# Altium project SBC_Project.PrjPcb (part 1 of 3)
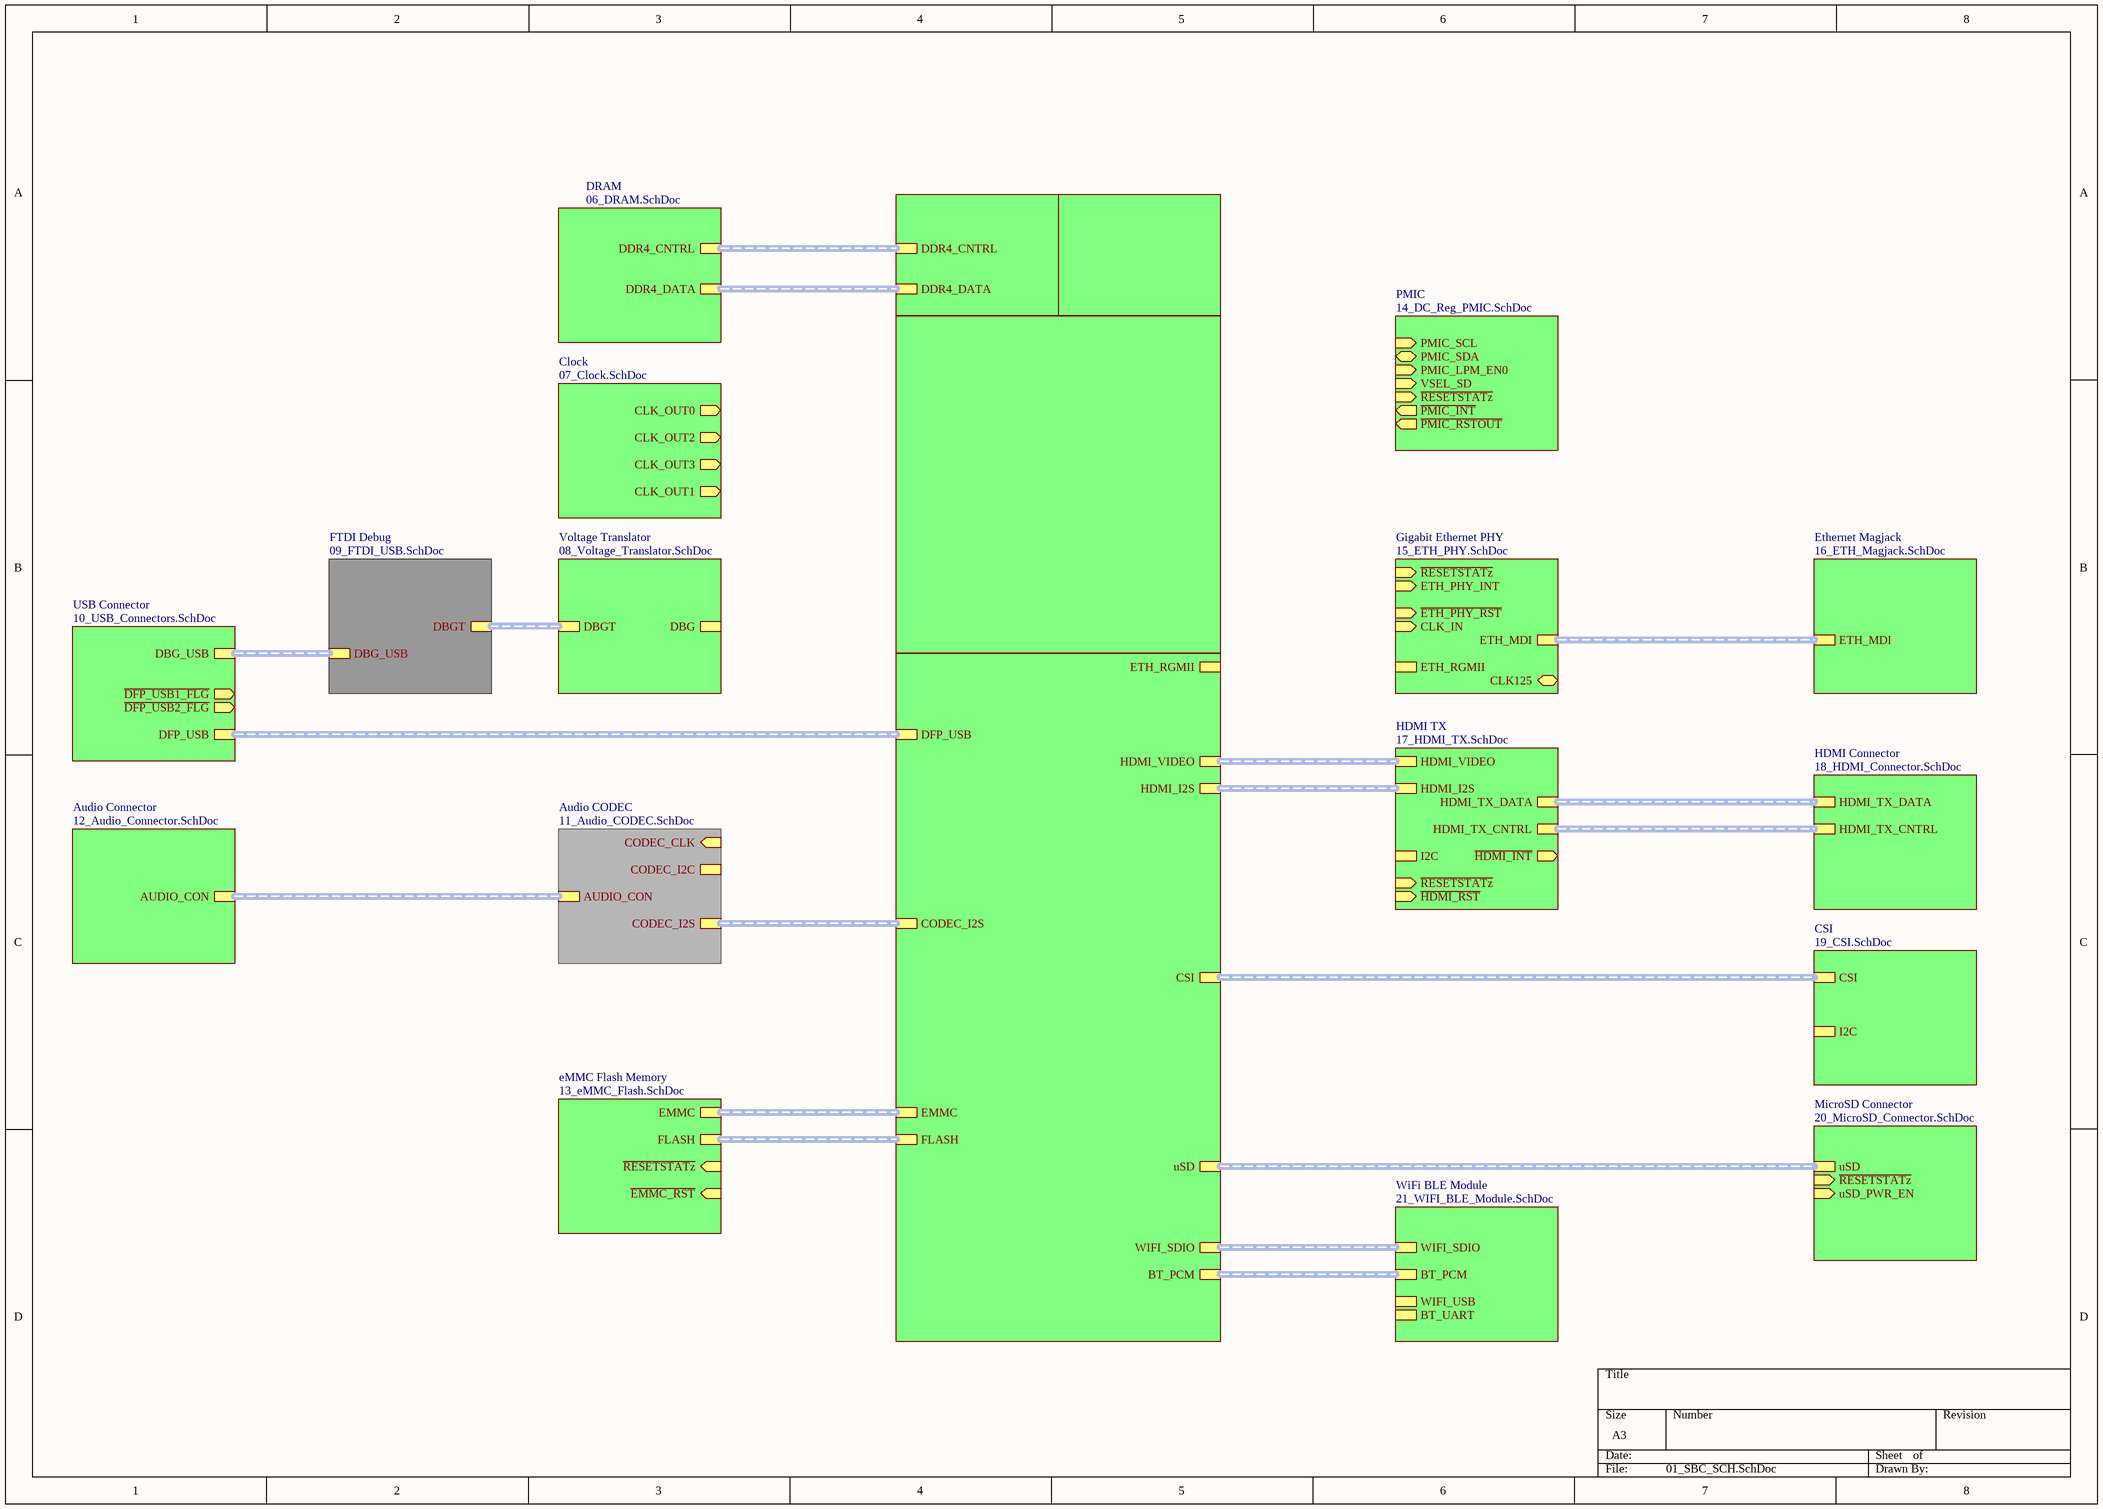
[diagram p0: 01_SBC_SCH.SchDoc]
21 sheets, 626 parts. Net scope: hierarchical (ports join the sheet entries above them; power ports are global).
Board file: SBC_PCB.PcbDoc
Sheets:
  01_SBC_SCH.SchDoc
    Audio CODEC = 11_Audio_CODEC.SchDoc
    Audio Connector = 12_Audio_Connector.SchDoc
    FTDI Debug = 09_FTDI_USB.SchDoc
    Gigabit Ethernet PHY = 15_ETH_PHY.SchDoc
    Ethernet Magjack = 16_ETH_Magjack.SchDoc
    PMIC = 14_DC_Reg_PMIC.SchDoc
    WiFi BLE Module = 21_WIFI_BLE_Module.SchDoc
    DRAM = 06_DRAM.SchDoc
    eMMC Flash Memory = 13_eMMC_Flash.SchDoc
    Voltage Translator = 08_Voltage_Translator.SchDoc
    MicroSD Connector = 20_MicroSD_Connector.SchDoc
    SoC Power = 03_SoC_Power.SchDoc
    Clock = 07_Clock.SchDoc
    SoC DRAM = 02_SoC_DRAM_DDR4.SchDoc
    SoC Interfaces = 05_SoC_Interfaces.SchDoc
    HDMI TX = 17_HDMI_TX.SchDoc
    HDMI Connector = 18_HDMI_Connector.SchDoc
    CSI = 19_CSI.SchDoc
    USB Connector = 10_USB_Connectors.SchDoc
    SoC Config & GPIOs = 04_SoC_CFG_GPIOs.SchDoc

## Sheet 01_SBC_SCH.SchDoc
size A3; SheetNumber: 1; SheetTotal: 21

### Sub-sheets
Audio CODEC = 11_Audio_CODEC.SchDoc: CODEC_I2S (harness CODEC_I2S), CODEC_I2C (harness CODEC_I2C), AUDIO_CON (harness AUDIO_CON), CODEC_CLK (in)
Audio Connector = 12_Audio_Connector.SchDoc: AUDIO_CON (harness AUDIO_CON)
Clock = 07_Clock.SchDoc: CLK_OUT0 (out), CLK_OUT1 (out), CLK_OUT2 (out), CLK_OUT3 (out)
CSI = 19_CSI.SchDoc: I2C (harness I2C), CSI (harness CSI)
DRAM = 06_DRAM.SchDoc: DDR4_CNTRL (harness DDR4_CNTRL), DDR4_DATA (harness DDR4_DATA)
eMMC Flash Memory = 13_eMMC_Flash.SchDoc: EMMC (harness EMMC), ~{RESETSTATz} (in), ~{EMMC_RST} (in), FLASH (harness FLASH)
Ethernet Magjack = 16_ETH_Magjack.SchDoc: ETH_MDI (harness ETH_MDI)
FTDI Debug = 09_FTDI_USB.SchDoc: DBGT (harness DBGT), DBG_USB (harness DBG_USB)
Gigabit Ethernet PHY = 15_ETH_PHY.SchDoc: CLK_IN (in), ETH_MDI (harness ETH_MDI), ETH_RGMII (harness ETH_RGMII), ETH_PHY_INT (in), ~{RESETSTATz} (in), ~{ETH_PHY_RST} (in), CLK125 (bidir)
HDMI Connector = 18_HDMI_Connector.SchDoc: HDMI_TX_DATA (harness HDMI_TX_DATA), HDMI_TX_CNTRL (harness HDMI_TX_CNTRL)
HDMI TX = 17_HDMI_TX.SchDoc: HDMI_VIDEO (harness HDMI_VIDEO), HDMI_I2S (harness HDMI_I2S), ~{RESETSTATz} (in), I2C (harness I2C), HDMI_TX_DATA (harness HDMI_TX_DATA), HDMI_TX_CNTRL (harness HDMI_TX_CNTRL), ~{HDMI_RST} (in), ~{HDMI_INT} (out)
MicroSD Connector = 20_MicroSD_Connector.SchDoc: uSD (harness uSD), ~{RESETSTATz} (in), uSD_PWR_EN (in)
PMIC = 14_DC_Reg_PMIC.SchDoc: PMIC_SCL (in), PMIC_SDA (bidir), PMIC_LPM_EN0 (in), VSEL_SD (in), ~{RESETSTATz} (in), ~{PMIC_INT} (out), ~{PMIC_RSTOUT} (out)
SoC Config & GPIOs = 04_SoC_CFG_GPIOs.SchDoc: no entries
SoC DRAM = 02_SoC_DRAM_DDR4.SchDoc: DDR4_CNTRL (harness DDR4_CNTRL), DDR4_DATA (harness DDR4_DATA)
SoC Interfaces = 05_SoC_Interfaces.SchDoc: EMMC (harness EMMC), WIFI_SDIO (harness WIFI_SDIO), uSD (harness uSD), FLASH (harness FLASH), BT_PCM (harness BT_PCM), CODEC_I2S (harness CODEC_I2S), ETH_RGMII (harness ETH_RGMII), HDMI_I2S (harness HDMI_I2S), HDMI_VIDEO (harness HDMI_VIDEO), CSI (harness CSI), DFP_USB (harness DFP_USB)
SoC Power = 03_SoC_Power.SchDoc: no entries
USB Connector = 10_USB_Connectors.SchDoc: DBG_USB (harness DBG_USB), DFP_USB (harness DFP_USB), ~{DFP_USB1_FLG} (out), ~{DFP_USB2_FLG} (out)
Voltage Translator = 08_Voltage_Translator.SchDoc: DBGT (harness DBGT), DBG (harness DBG)
WiFi BLE Module = 21_WIFI_BLE_Module.SchDoc: WIFI_SDIO (harness WIFI_SDIO), BT_UART (harness BT_UART), BT_PCM (harness BT_PCM), WIFI_USB (harness WIFI_USB)

### Buses and harness runs
harness sheet Audio CODEC/AUDIO_CON = sheet Audio Connector/AUDIO_CON
harness sheet Audio CODEC/CODEC_I2S = sheet SoC Interfaces/CODEC_I2S
harness sheet CSI/CSI = sheet SoC Interfaces/CSI
harness sheet DRAM/DDR4_CNTRL = sheet SoC DRAM/DDR4_CNTRL
harness sheet DRAM/DDR4_DATA = sheet SoC DRAM/DDR4_DATA
harness sheet eMMC Flash Memory/EMMC = sheet SoC Interfaces/EMMC
harness sheet eMMC Flash Memory/FLASH = sheet SoC Interfaces/FLASH
harness sheet Ethernet Magjack/ETH_MDI = sheet Gigabit Ethernet PHY/ETH_MDI
harness sheet FTDI Debug/DBG_USB = sheet USB Connector/DBG_USB
harness sheet FTDI Debug/DBGT = sheet Voltage Translator/DBGT
harness sheet HDMI Connector/HDMI_TX_CNTRL = sheet HDMI TX/HDMI_TX_CNTRL
harness sheet HDMI Connector/HDMI_TX_DATA = sheet HDMI TX/HDMI_TX_DATA
harness sheet HDMI TX/HDMI_I2S = sheet SoC Interfaces/HDMI_I2S
harness sheet HDMI TX/HDMI_VIDEO = sheet SoC Interfaces/HDMI_VIDEO
harness sheet MicroSD Connector/uSD = sheet SoC Interfaces/uSD
harness sheet SoC Interfaces/BT_PCM = sheet WiFi BLE Module/BT_PCM
harness sheet SoC Interfaces/DFP_USB = sheet USB Connector/DFP_USB
harness sheet SoC Interfaces/WIFI_SDIO = sheet WiFi BLE Module/WIFI_SDIO

## Sheet 11_Audio_CODEC.SchDoc
size A3; SheetNumber: 2; SheetTotal: 21
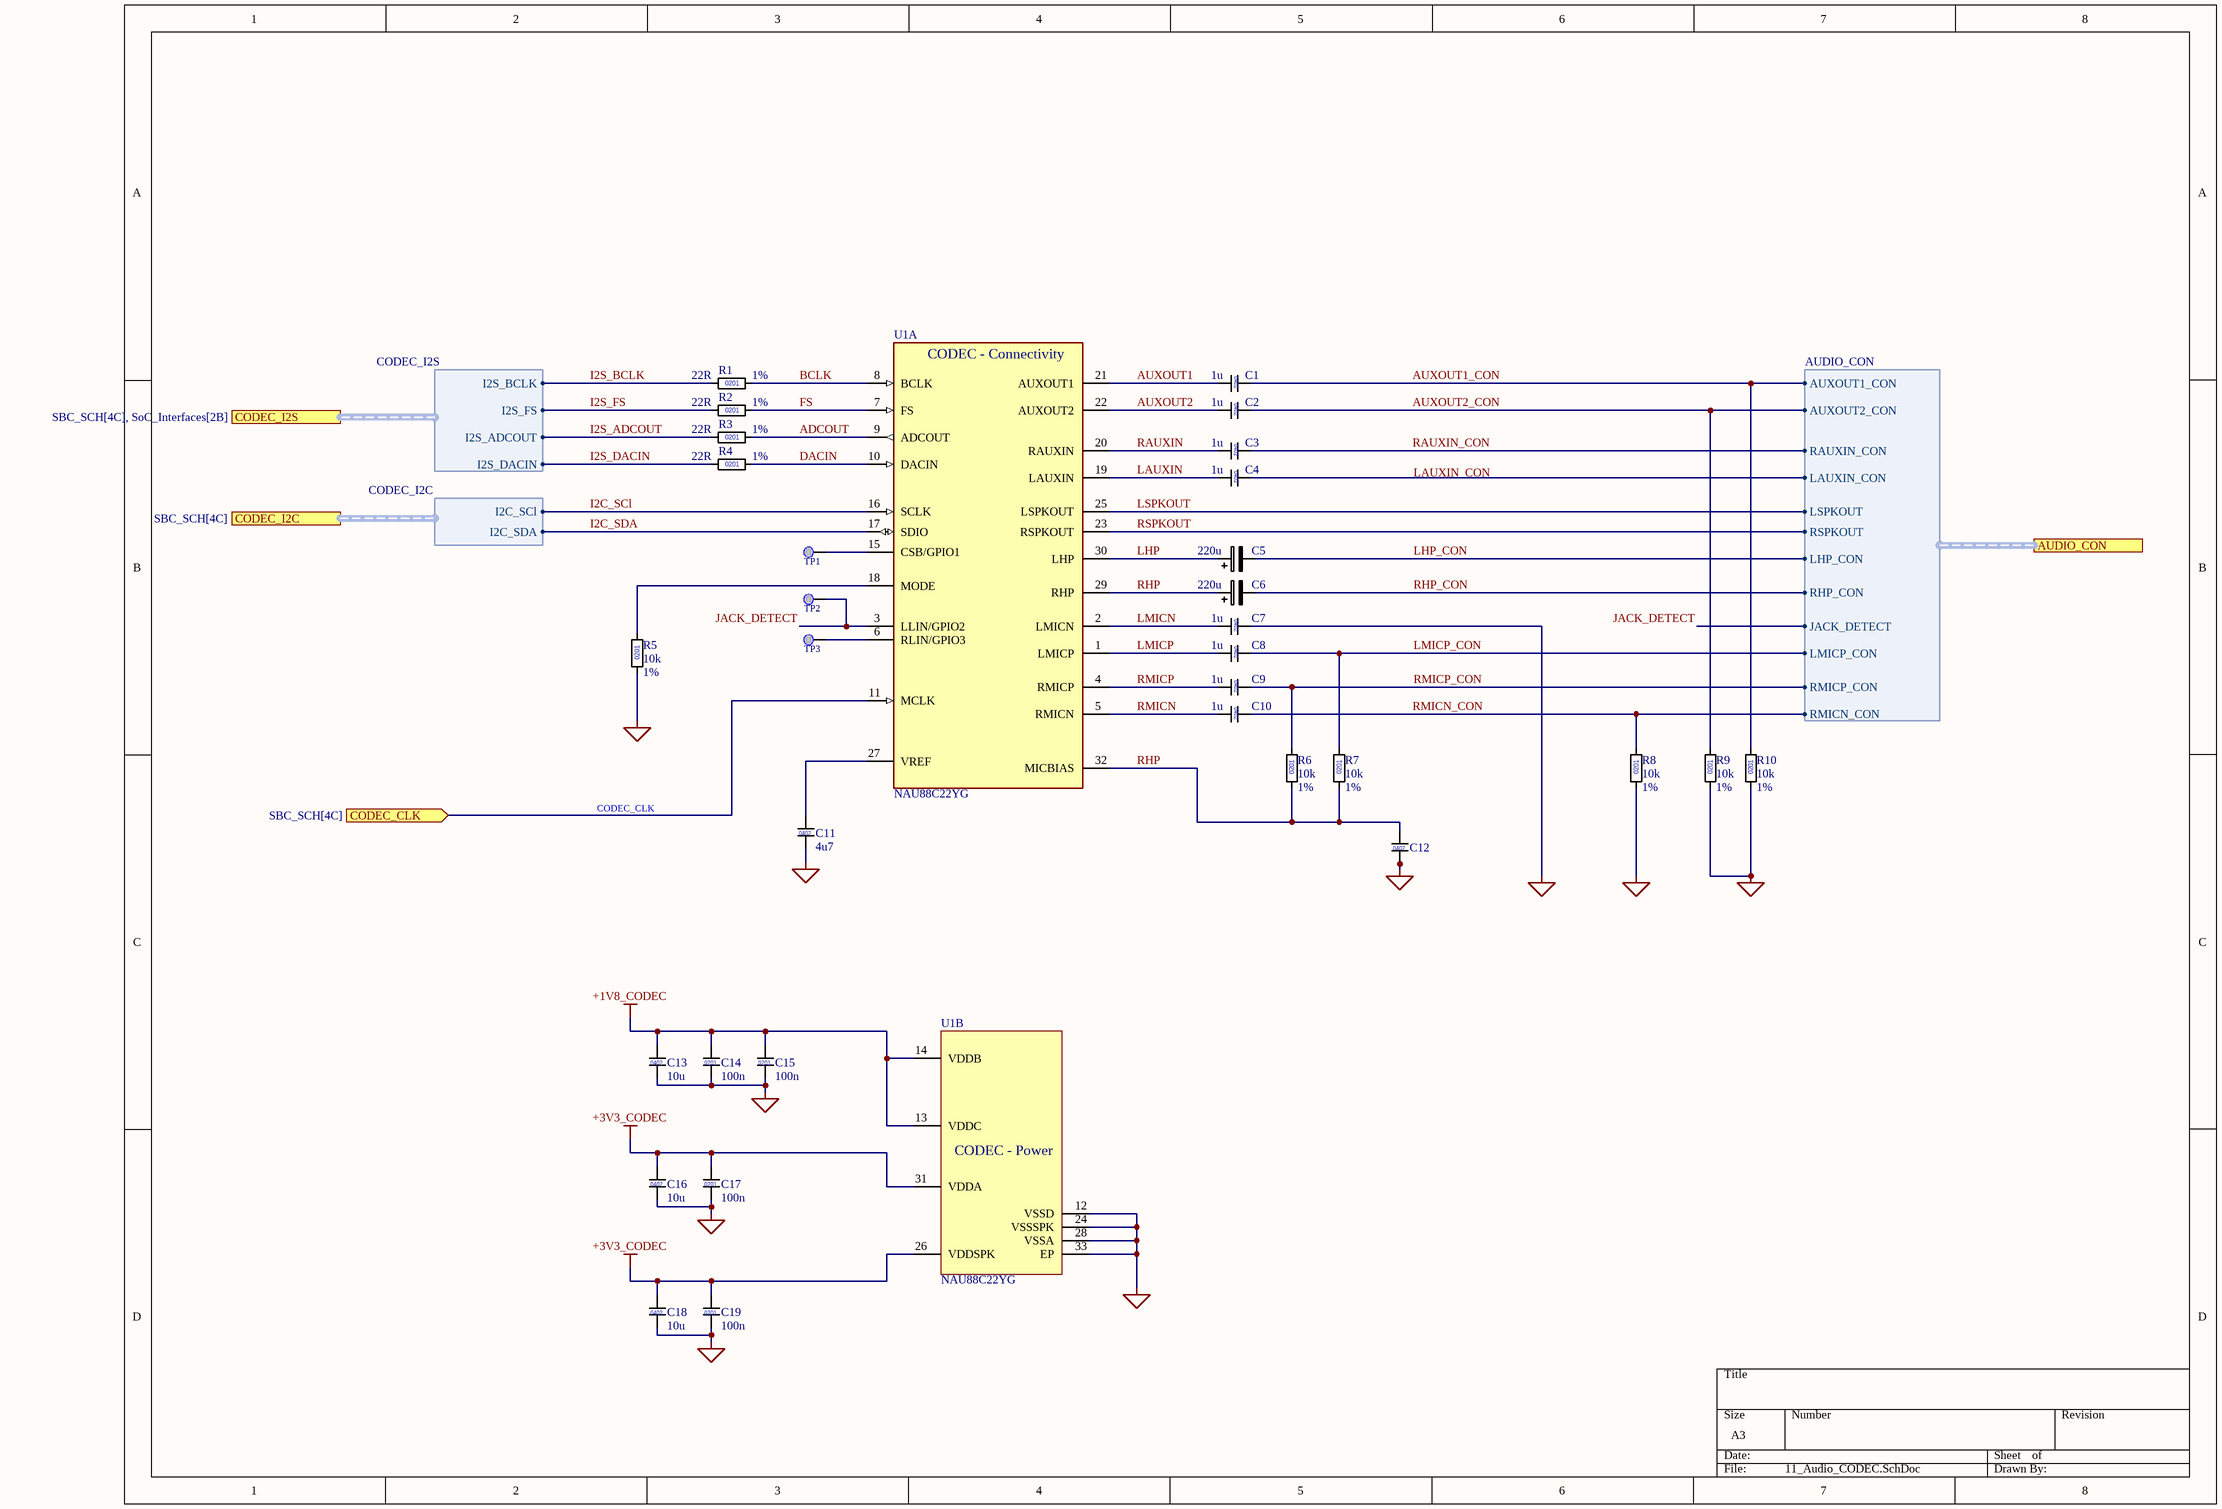
[diagram p1: 11_Audio_CODEC.SchDoc]

### Parts
C1  1u  [C0402]
C2  1u  [C0402]
C3  1u  [C0402]
C4  1u  [C0402]
C5  220u
C6  220u
C7  1u  [C0402]
C8  1u  [C0402]
C9  1u  [C0402]
C10  1u  [C0402]
C11  4u7  [C0402]
C12  1u  [C0402]  (value not drawn)
C13  value 10u  [C0402]  (hidden comment: 4u7)
C14  value 100n  [C0201]  (hidden comment: C_0201)
C15  value 100n  [C0201]  (hidden comment: C_0201)
C16  value 10u  [C0402]  (hidden comment: 4u7)
C17  value 100n  [C0201]  (hidden comment: C_0201)
C18  value 10u  [C0402]  (hidden comment: 4u7)
C19  value 100n  [C0201]  (hidden comment: C_0201)
R1  value 22R  Tolerance: 1%  [R0201]  (hidden comment: 0201)
R2  value 22R  Tolerance: 1%  [R0201]  (hidden comment: 0201)
R3  value 22R  Tolerance: 1%  [R0201]  (hidden comment: 0201)
R4  value 22R  Tolerance: 1%  [R0201]  (hidden comment: 0201)
R5  value 10k  Tolerance: 1%  [R0201]  (hidden comment: 0201)
R6  value 10k  Tolerance: 1%  [R0201]  (hidden comment: 0201)
R7  value 10k  Tolerance: 1%  [R0201]  (hidden comment: 0201)
R8  value 10k  Tolerance: 1%  [R0201]  (hidden comment: 0201)
R9  value 10k  Tolerance: 1%  [R0201]  (hidden comment: 0201)
R10  value 10k  Tolerance: 1%  [R0201]  (hidden comment: 0201)
TP1  Testpoint 0.5mm  [TP_0.50mm]  (value not drawn)  (no BOM)
TP2  Testpoint 0.5mm  [TP_0.50mm]  (value not drawn)  (no BOM)
TP3  Testpoint 0.5mm  [TP_0.50mm]  (value not drawn)  (no BOM)
U1  NAU88C22YG  [VQFN-32-1EP_5x5mm_P0.5mm_EP3.5x3.5mm]  (parts A,B of 2)

### Ports
AUDIO_CON (harness AUDIO_CON, see SBC_SCH[4C], Audio_Connector[1B]), CODEC_CLK (in, see SBC_SCH[4C]), CODEC_I2C (harness CODEC_I2C, see SBC_SCH[4C]), CODEC_I2S (harness CODEC_I2S, see SBC_SCH[4C], SoC_Interfaces[2B])

### Harnesses
CODEC_I2S: I2S_BCLK, I2S_FS, I2S_ADCOUT, I2S_DACIN
CODEC_I2C: I2C_SCl, I2C_SDA
AUDIO_CON: AUXOUT1_CON, AUXOUT2_CON, RAUXIN_CON, LAUXIN_CON, LHP_CON, RHP_CON, LMICP_CON, RMICP_CON, RMICN_CON, LSPKOUT, RSPKOUT, JACK_DETECT

### Nets
+1V8_CODEC: C13.1 C14.1 C15.1 U1.13(VDDC) U1.14(VDDB)
+3V3_CODEC: C16.1 C17.1 C18.1 C19.1 U1.26(VDDSPK) U1.31(VDDA)
GND: C7.2 C11.2 C12.2 C13.2 C14.2 C15.2 C16.2 C17.2 C18.2 C19.2 R5.1 R8.1 R9.1 R10.1 U1.12(VSSD) U1.24(VSSSPK) U1.28(VSSA) U1.33(EP)
ADCOUT: R3.2 U1.9(ADCOUT)
AUXOUT1: C1.1 U1.21(AUXOUT1)
AUXOUT1_CON: C1.2 R10.2 ; port AUDIO_CON.AUXOUT1_CON
AUXOUT2: C2.1 U1.22(AUXOUT2)
AUXOUT2_CON: C2.2 R9.2 ; port AUDIO_CON.AUXOUT2_CON
BCLK: R1.2 U1.8(BCLK)
CODEC_CLK: U1.11(MCLK) ; port CODEC_CLK
DACIN: R4.2 U1.10(DACIN)
FS: R2.2 U1.7(FS)
I2C_SCl: U1.16(SCLK) ; port CODEC_I2C.I2C_SCl
I2C_SDA: U1.17(SDIO) ; port CODEC_I2C.I2C_SDA
I2S_ADCOUT: R3.1 ; port CODEC_I2S.I2S_ADCOUT
I2S_BCLK: R1.1 ; port CODEC_I2S.I2S_BCLK
I2S_DACIN: R4.1 ; port CODEC_I2S.I2S_DACIN
I2S_FS: R2.1 ; port CODEC_I2S.I2S_FS
JACK_DETECT: TP2.TP U1.3(LLIN/GPIO2) ; port AUDIO_CON.JACK_DETECT
LAUXIN: C4.1 U1.19(LAUXIN)
LHP: C5.1 U1.30(LHP)
LHP_CON: C5.2 ; port AUDIO_CON.LHP_CON
LMICN: C7.1 U1.2(LMICN)
LMICP: C8.1 U1.1(LMICP)
LMICP_CON: C8.2 R7.2 ; port AUDIO_CON.LMICP_CON
LSPKOUT: U1.25(LSPKOUT) ; port AUDIO_CON.LSPKOUT
RAUXIN: C3.1 U1.20(RAUXIN)
RAUXIN_CON: C3.2 ; port AUDIO_CON.RAUXIN_CON
RHP: C6.1 C12.1 R6.1 R7.1 U1.29(RHP) U1.32(MICBIAS)
RHP_CON: C6.2 ; port AUDIO_CON.RHP_CON
RMICN: C10.1 U1.5(RMICN)
RMICN_CON: C10.2 R8.2 ; port AUDIO_CON.RMICN_CON
RMICP: C9.1 U1.4(RMICP)
RMICP_CON: C9.2 R6.2 ; port AUDIO_CON.RMICP_CON
RSPKOUT: U1.23(RSPKOUT) ; port AUDIO_CON.RSPKOUT
NetC4_2: C4.2 ; port AUDIO_CON.LAUXIN_CON
NetC11_1: C11.1 U1.27(VREF)
NetR5_2: R5.2 U1.18(MODE)
NetTP1_TP: TP1.TP U1.15(CSB/GPIO1)
NetTP3_TP: TP3.TP U1.6(RLIN/GPIO3)

### Notes on the sheet
- Labels drawn without touching a wire or pin: LAUXIN_CON
- (in symbol C_0201) 0201
- (in symbol C_0402) 0402
- (in symbol NAU88C22YG, part A) CODEC - Connectivity
- (in symbol NAU88C22YG, part B) CODEC - Power

### Library data of the parts
C1-C4 C7-C13 C16 C18 = C_0402: MLCC 0402; Manufacturer_Name: *; Manufacturer_Part_Number: *
  C1-C4 C7-C10: Value: 1u
  C11: Value: 4u7
C5 C6 = C_Polarized: Polarized capacitor; Manufacturer_Name: *; Manufacturer_Part_Number: *; Value: 220u
C14 C15 C17 C19 = C_0201: MLCC 0201; Manufacturer_Name: *; Manufacturer_Part_Number: *
R1-R10 = R_0201: Manufacturer_Name: *; Manufacturer_Part_Number: *
U1 = NAU88C22YG: Audio CODEC 24 b I2S, PCM; Datasheet: https://datasheetspdf.com/pdf-file/1134755/nuvoton/NAU88C22/1; ComponentLink1Description: Datasheet; ComponentLink1URL: https://datasheetspdf.com/pdf-file/1134755/nuvoton/NAU88C22/1; Manufacturer_Name: *; Manufacturer_Part_Number: *

## Sheet 12_Audio_Connector.SchDoc
size A3; SheetNumber: 3; SheetTotal: 15
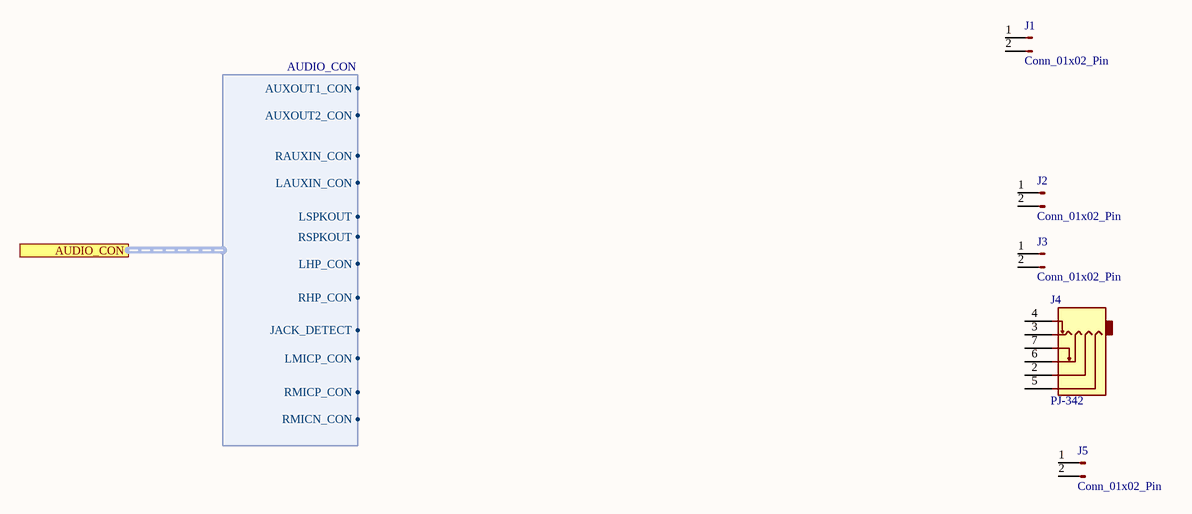
[diagram p2: 12_Audio_Connector.SchDoc]

### Parts
J1  Conn_01x02_Pin
J2  Conn_01x02_Pin
J3  Conn_01x02_Pin
J4  value PJ-342  [PJ-342]  (hidden comment: AudioJack4_SwitchTR1)
J5  Conn_01x02_Pin

### Ports
AUDIO_CON (harness AUDIO_CON, see SBC_SCH[6B], Audio_CODEC[8B])

### Harnesses
AUDIO_CON: AUXOUT1_CON, AUXOUT2_CON, RAUXIN_CON, LAUXIN_CON, LHP_CON, RHP_CON, LMICP_CON, RMICP_CON, RMICN_CON, LSPKOUT, RSPKOUT, JACK_DETECT

### Nets

Not connected (* = marked no-connect by the designer): J1 1(Pin_1) 2(Pin_2); J2 1(Pin_1) 2(Pin_2); J3 1(Pin_1) 2(Pin_2); J4 2(R2) 3(T) 4(TN) 5 6(R1) 7(R1N); J5 1(Pin_1) 2(Pin_2)

### Library data of the parts
J1-J3 J5 = Conn_01x02_Pin: Generic connector, single row, 01x02, script generated
J4 = PJ-342: 3.5mm Headphone Jack 30V 500mA Copper Gold SMD Audio Connectors ROHS; Manufacturer_Name: SHOU HAN; Manufacturer_Part_Number: PJ-342

## Sheet 09_FTDI_USB.SchDoc
size A3; SheetNumber: 4; SheetTotal: 21
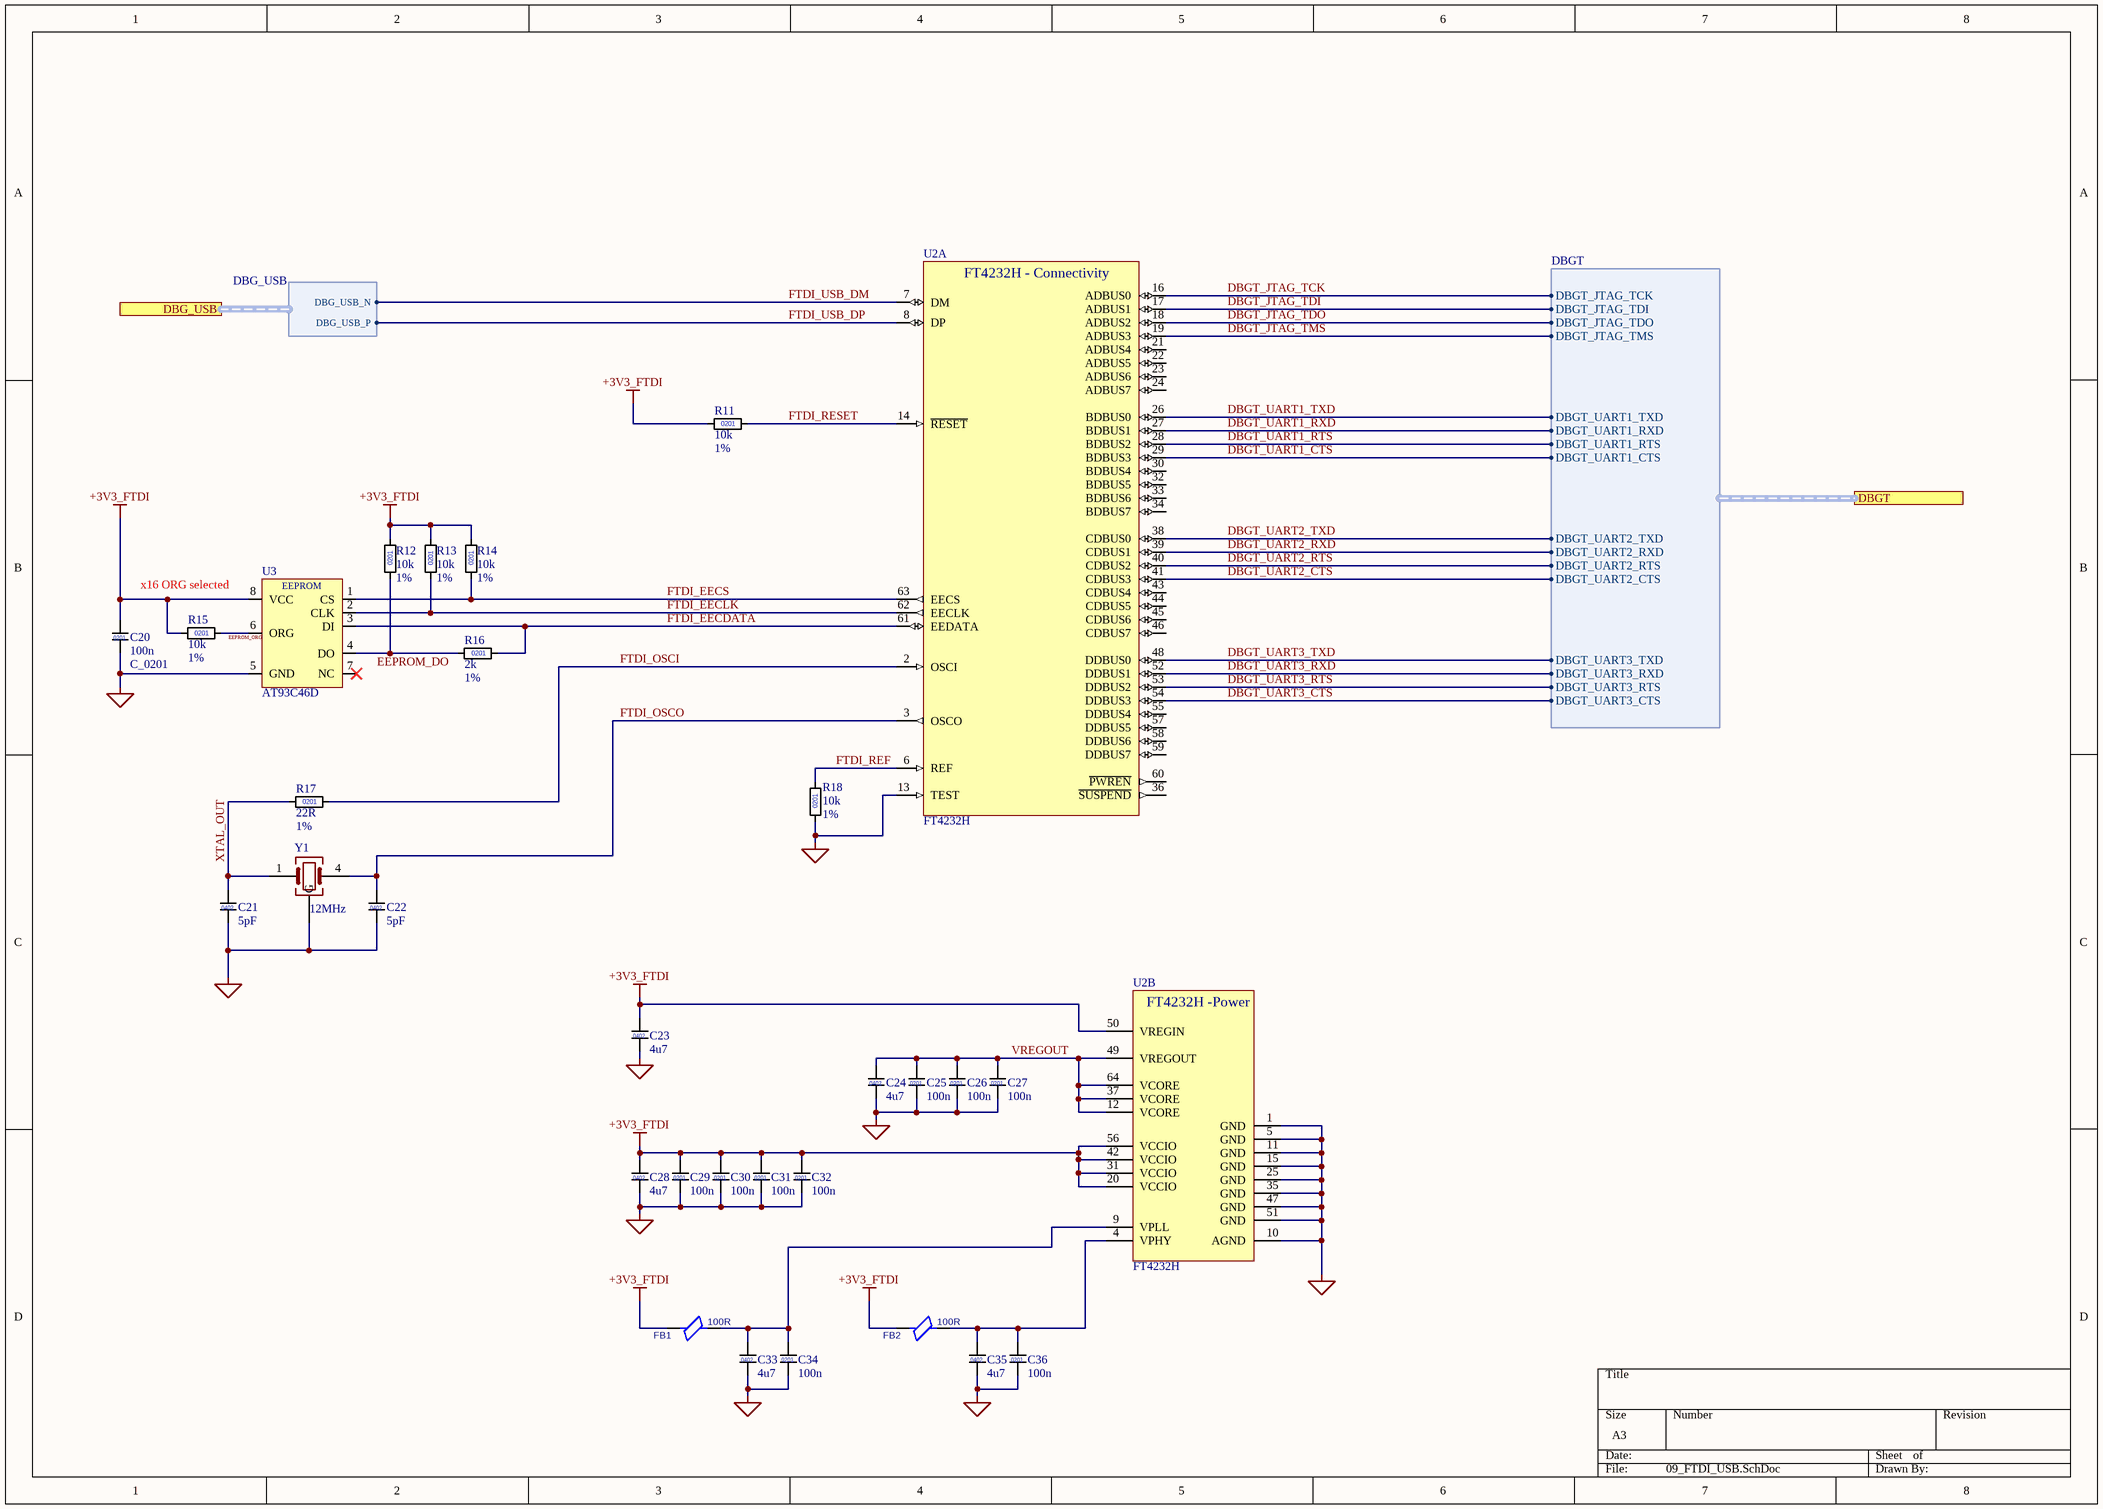
[diagram p3: 09_FTDI_USB.SchDoc]

### Parts
C20  C_0201  value 100n  [C0201]
C21  value 5pF  [C0201]  (hidden comment: C_0201)
C22  value 5pF  [C0201]  (hidden comment: C_0201)
C23  value 4u7  [C0402]  (hidden comment: C_0402)
C24  value 4u7  [C0402]  (hidden comment: C_0402)
C25  value 100n  [C0201]  (hidden comment: C_0201)
C26  value 100n  [C0201]  (hidden comment: C_0201)
C27  value 100n  [C0201]  (hidden comment: C_0201)
C28  value 4u7  [C0402]  (hidden comment: C_0402)
C29  value 100n  [C0201]  (hidden comment: C_0201)
C30  value 100n  [C0201]  (hidden comment: C_0201)
C31  value 100n  [C0201]  (hidden comment: C_0201)
C32  value 100n  [C0201]  (hidden comment: C_0201)
C33  value 4u7  [C0402]  (hidden comment: C_0402)
C34  value 100n  [C0201]  (hidden comment: C_0201)
C35  value 4u7  [C0402]  (hidden comment: C_0402)
C36  value 100n  [C0201]  (hidden comment: C_0201)
FB1  value 100R  [FB0201]  (hidden comment: FB_0201)
FB2  value 100R  [FB0201]  (hidden comment: FB_0201)
R11  value 10k  Tolerance: 1%  [R0201]  (hidden comment: 0201)
R12  value 10k  Tolerance: 1%  [R0201]  (hidden comment: 0201)
R13  value 10k  Tolerance: 1%  [R0201]  (hidden comment: 0201)
R14  value 10k  Tolerance: 1%  [R0201]  (hidden comment: 0201)
R15  value 10k  Tolerance: 1%  [R0201]  (hidden comment: 0201)
R16  value 2k  Tolerance: 1%  [R0201]  (hidden comment: 0201)
R17  value 22R  Tolerance: 1%  [R0201]  (hidden comment: 0201)
R18  value 10k  Tolerance: 1%  [R0201]  (hidden comment: 0201)
U2  FT4232H  [LQFP-64_10x10mm_P0.5mm]  (parts A,B of 2)
U3  AT93C46D
Y1  12MHz

### Ports
DBG_USB (harness DBG_USB), DBGT (harness DBGT, see SBC_SCH[2B], Voltage_Translator[1B])

### Harnesses
DBGT: DBGT_JTAG_TCK, DBGT_JTAG_TDI, DBGT_JTAG_TDO, DBGT_JTAG_TMS, DBGT_UART1_TXD, DBGT_UART1_RXD, DBGT_UART1_RTS, DBGT_UART1_CTS, DBGT_UART2_TXD, DBGT_UART2_RXD, DBGT_UART2_RTS, DBGT_UART2_CTS, DBGT_UART3_TXD, DBGT_UART3_RXD, DBGT_UART3_RTS, DBGT_UART3_CTS
DBG_USB: DBG_USB_N, DBG_USB_P

### Nets
+3V3_FTDI: C20.1 C23.1 C28.1 C29.1 C30.1 C31.1 C32.1 FB1.1 FB2.1 R11.1 R12.R? R13.R? R14.R? R15.1 U2.20(VCCIO) U2.31(VCCIO) U2.42(VCCIO) U2.50(VREGIN) U2.56(VCCIO) U3.8(VCC)
GND: C20.2 C21.2 C22.2 C23.2 C24.2 C25.2 C26.2 C27.2 C28.2 C29.2 C30.2 C31.2 C32.2 C33.2 C34.2 C35.2 C36.2 R18.1 U2.1(GND) U2.5(GND) U2.10(AGND) U2.11(GND) U2.13(TEST) U2.15(GND) U2.25(GND) U2.35(GND) U2.47(GND) U2.51(GND) U3.5(GND) Y1.2,3(G)
DBGT_JTAG_TCK: U2.16(ADBUS0) ; port DBGT.DBGT_JTAG_TCK
DBGT_JTAG_TDI: U2.17(ADBUS1) ; port DBGT.DBGT_JTAG_TDI
DBGT_JTAG_TDO: U2.18(ADBUS2) ; port DBGT.DBGT_JTAG_TDO
DBGT_JTAG_TMS: U2.19(ADBUS3) ; port DBGT.DBGT_JTAG_TMS
DBGT_UART1_CTS: U2.29(BDBUS3) ; port DBGT.DBGT_UART1_CTS
DBGT_UART1_RTS: U2.28(BDBUS2) ; port DBGT.DBGT_UART1_RTS
DBGT_UART1_RXD: U2.27(BDBUS1) ; port DBGT.DBGT_UART1_RXD
DBGT_UART1_TXD: U2.26(BDBUS0) ; port DBGT.DBGT_UART1_TXD
DBGT_UART2_CTS: U2.41(CDBUS3) ; port DBGT.DBGT_UART2_CTS
DBGT_UART2_RTS: U2.40(CDBUS2) ; port DBGT.DBGT_UART2_RTS
DBGT_UART2_RXD: U2.39(CDBUS1) ; port DBGT.DBGT_UART2_RXD
DBGT_UART2_TXD: U2.38(CDBUS0) ; port DBGT.DBGT_UART2_TXD
DBGT_UART3_CTS: U2.54(DDBUS3) ; port DBGT.DBGT_UART3_CTS
DBGT_UART3_RTS: U2.53(DDBUS2) ; port DBGT.DBGT_UART3_RTS
DBGT_UART3_RXD: U2.52(DDBUS1) ; port DBGT.DBGT_UART3_RXD
DBGT_UART3_TXD: U2.48(DDBUS0) ; port DBGT.DBGT_UART3_TXD
EEPROM_DO: R12.1 R16.1 U3.4(DO)
EEPROM_ORG: R15.R? U3.6(ORG)
FTDI_EECDATA: R16.R? U2.61(EEDATA) U3.3(DI)
FTDI_EECLK: R13.1 U2.62(EECLK) U3.2(CLK)
FTDI_EECS: R14.1 U2.63(EECS) U3.1(CS)
FTDI_OSCI: R17.R? U2.2(OSCI)
FTDI_OSCO: C22.1 U2.3(OSCO) Y1.4
FTDI_REF: R18.R? U2.6(REF)
FTDI_RESET: R11.R? U2.14(~{RESET})
FTDI_USB_DM: U2.7(DM) ; port DBG_USB.DBG_USB_N  [project net DBG_USB_N]
FTDI_USB_DP: U2.8(DP) ; port DBG_USB.DBG_USB_P  [project net DBG_USB_P]
VREGOUT: C24.1 C25.1 C26.1 C27.1 U2.12(VCORE) U2.37(VCORE) U2.49(VREGOUT) U2.64(VCORE)
XTAL_OUT: C21.1 R17.1 Y1.1
NetC33_1: C33.1 C34.1 FB1.2 U2.9(VPLL)
NetC35_1: C35.1 C36.1 FB2.2 U2.4(VPHY)

Not connected (* = marked no-connect by the designer): U2 21(ADBUS4) 22(ADBUS5) 23(ADBUS6) 24(ADBUS7) 30(BDBUS4) 32(BDBUS5) 33(BDBUS6) 34(BDBUS7) 36(~{SUSPEND}) 43(CDBUS4) 44(CDBUS5) 45(CDBUS6) 46(CDBUS7) 55(DDBUS4) 57(DDBUS5) 58(DDBUS6) 59(DDBUS7) 60(~{PWREN}); U3 7(NC)*

### Notes on the sheet
- x16 ORG selected
- (in symbol AT93C46D) EEPROM
- (in symbol C_0201) 0402; 0201
- (in symbol C_0402) 0402
- (in symbol FT4232H, part A) FT4232H - Connectivity
- (in symbol FT4232H, part B) FT4232H -Power

### Library data of the parts
C20-C22 C25-C27 C29-C32 C34 C36 = C_0201: MLCC 0201; Manufacturer_Name: *; Manufacturer_Part_Number: *
C23 C24 C28 C33 C35 = C_0402: MLCC 0402; Manufacturer_Name: *; Manufacturer_Part_Number: *
R11-R18 = R_0201: Manufacturer_Name: *; Manufacturer_Part_Number: *
U2 = FT4232H: Hi Speed Quad Channel USB UART/FIFO, LQFP/QFN-64; Datasheet: https://www.ftdichip.com/Support/Documents/DataSheets/ICs/DS_FT4232H.pdf; ComponentLink1Description: Datasheet; ComponentLink1URL: https://www.ftdichip.com/Support/Documents/DataSheets/ICs/DS_FT4232H.pdf; Manufacturer_Name: *; Manufacturer_Part_Number: *
Y1 = Crystal_GND23: Four pin crystal, GND on pins 2 and 3; private: KLC_S4.1
FB1 FB2 = FB_0201: Parameter 1: *

## Sheet 15_ETH_PHY.SchDoc
size A3; SheetNumber: 5; SheetTotal: 21
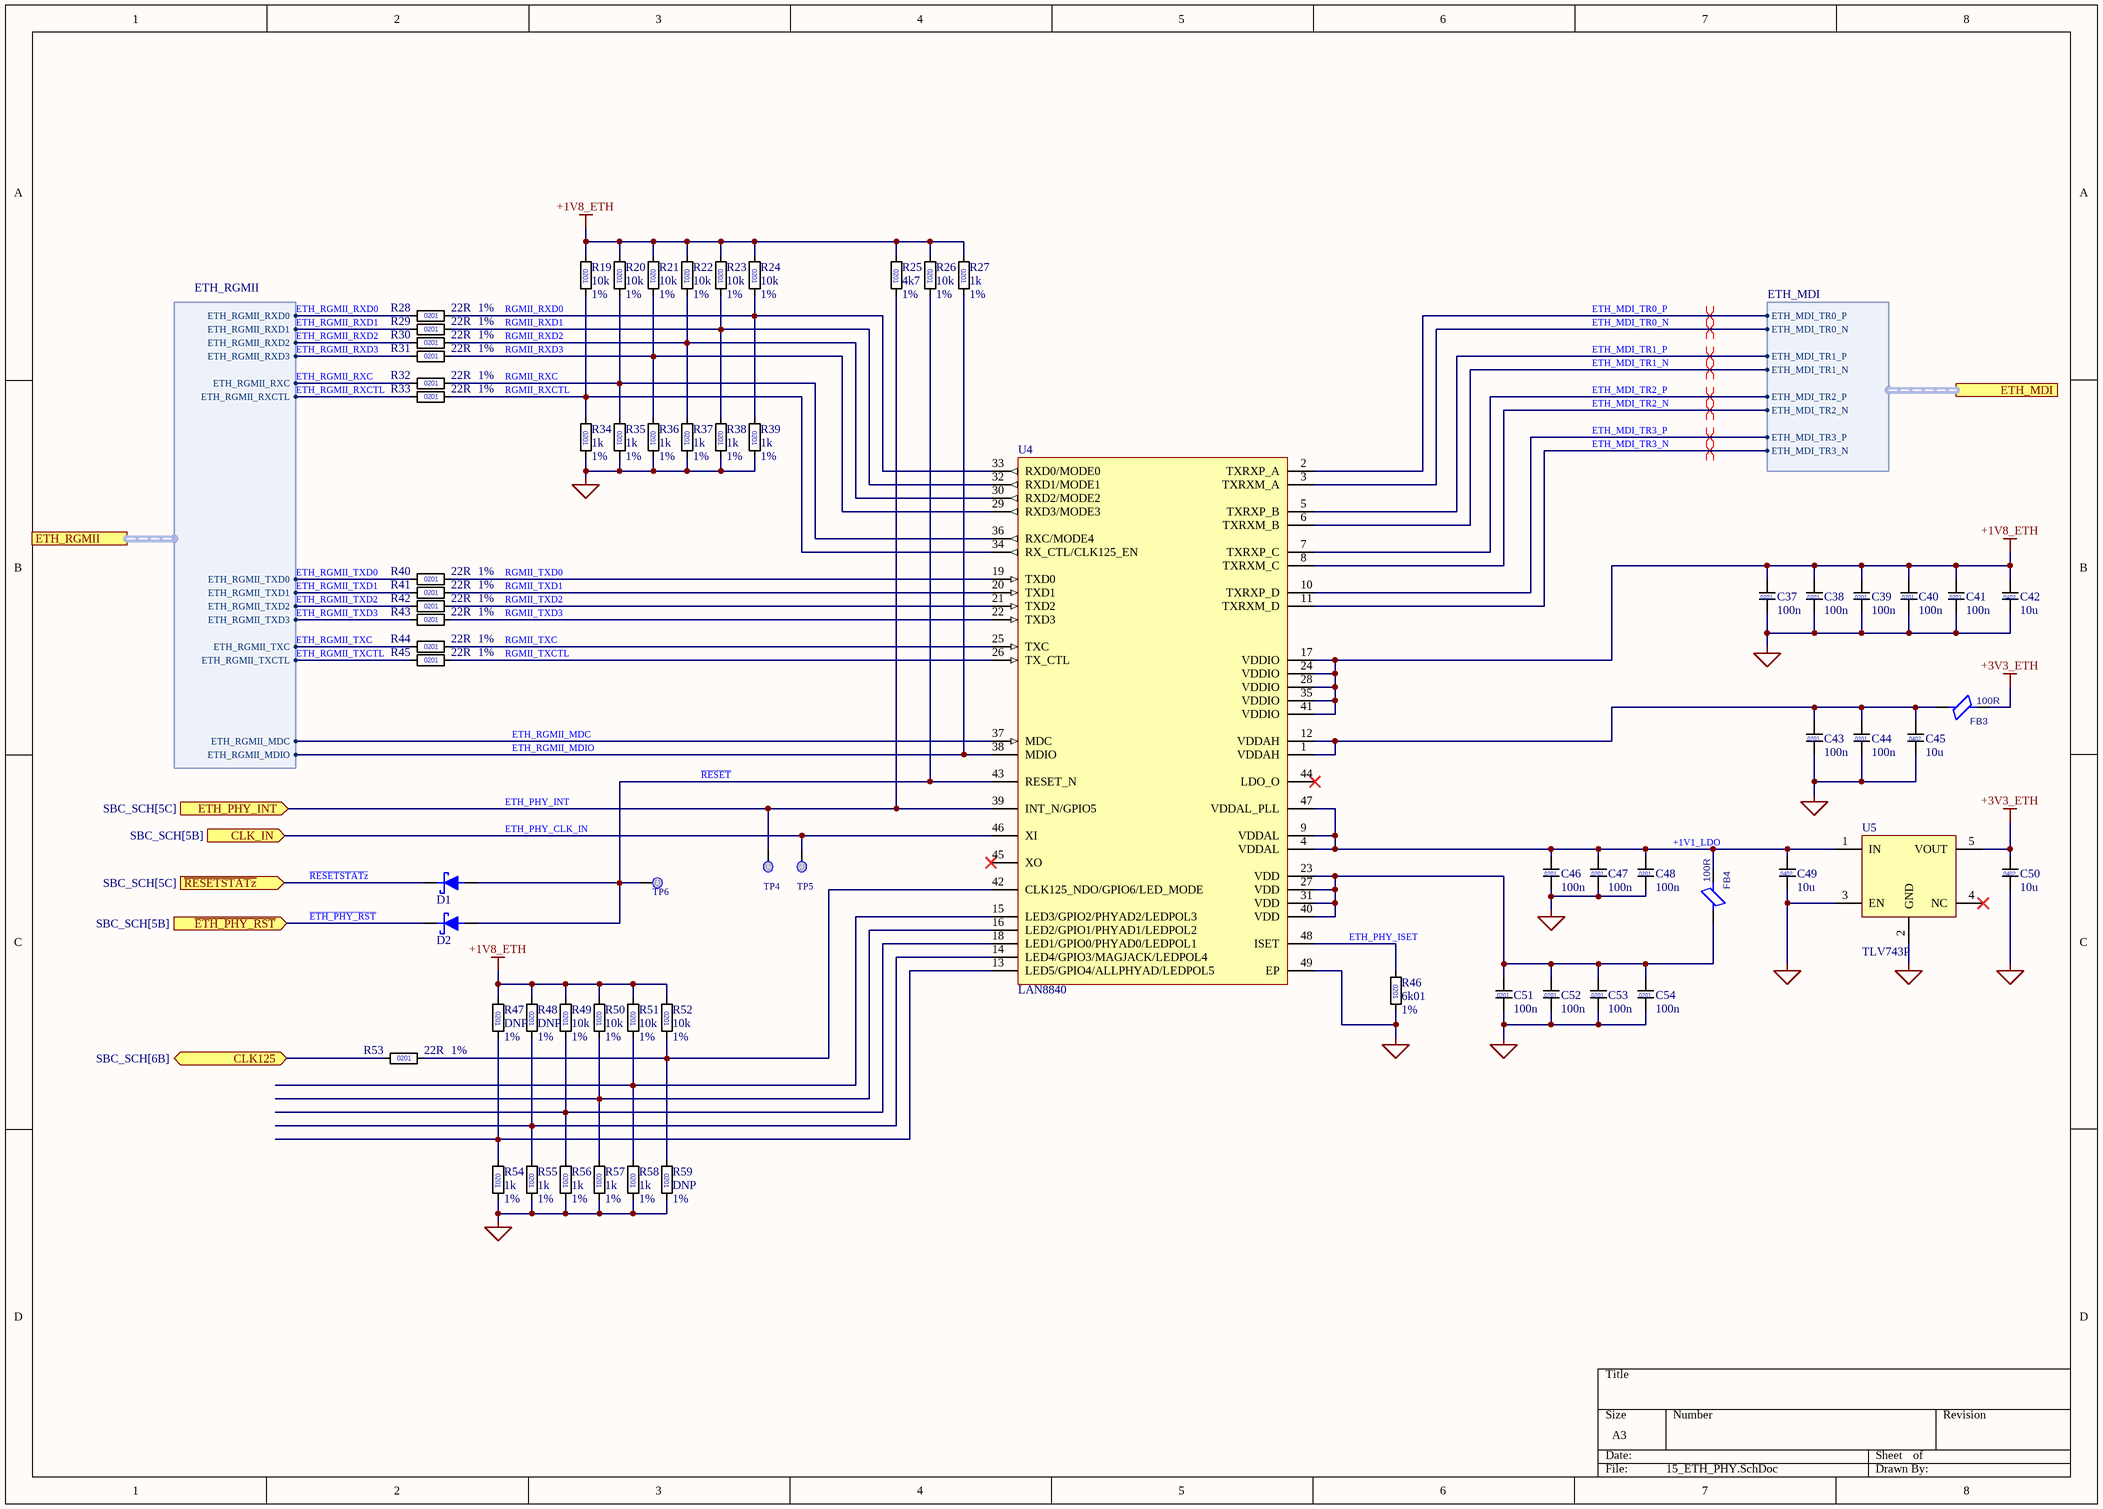
[diagram p4: 15_ETH_PHY.SchDoc]

### Parts
C37  value 100n  [C0201]  (hidden comment: C_0201)
C38  value 100n  [C0201]  (hidden comment: C_0201)
C39  value 100n  [C0201]  (hidden comment: C_0201)
C40  value 100n  [C0201]  (hidden comment: C_0201)
C41  value 100n  [C0201]  (hidden comment: C_0201)
C42  value 10u  [C0402]  (hidden comment: 4u7)
C43  value 100n  [C0201]  (hidden comment: C_0201)
C44  value 100n  [C0201]  (hidden comment: C_0201)
C45  value 10u  [C0402]  (hidden comment: 4u7)
C46  value 100n  [C0201]  (hidden comment: C_0201)
C47  value 100n  [C0201]  (hidden comment: C_0201)
C48  value 100n  [C0201]  (hidden comment: C_0201)
C49  value 10u  [C0402]  (hidden comment: 4u7)
C50  value 10u  [C0402]  (hidden comment: 4u7)
C51  value 100n  [C0201]  (hidden comment: C_0201)
C52  value 100n  [C0201]  (hidden comment: C_0201)
C53  value 100n  [C0201]  (hidden comment: C_0201)
C54  value 100n  [C0201]  (hidden comment: C_0201)
D1  D_Filled  [D_SOD-523]  (value not drawn)
D2  D_Filled  [D_SOD-523]  (value not drawn)
FB3  value 100R  [FB0201]  (hidden comment: FB_0201)
FB4  value 100R  [FB0201]  (hidden comment: FB_0201)
R19  value 10k  Tolerance: 1%  [R0201]  (hidden comment: 0201)
R20  value 10k  Tolerance: 1%  [R0201]  (hidden comment: 0201)
R21  value 10k  Tolerance: 1%  [R0201]  (hidden comment: 0201)
R22  value 10k  Tolerance: 1%  [R0201]  (hidden comment: 0201)
R23  value 10k  Tolerance: 1%  [R0201]  (hidden comment: 0201)
R24  value 10k  Tolerance: 1%  [R0201]  (hidden comment: 0201)
R25  value 4k7  Tolerance: 1%  [R0201]  (hidden comment: 0201)
R26  value 10k  Tolerance: 1%  [R0201]  (hidden comment: 0201)
R27  value 1k  Tolerance: 1%  [R0201]  (hidden comment: 0201)
R28  value 22R  Tolerance: 1%  [R0201]  (hidden comment: 0201)
R29  value 22R  Tolerance: 1%  [R0201]  (hidden comment: 0201)
R30  value 22R  Tolerance: 1%  [R0201]  (hidden comment: 0201)
R31  value 22R  Tolerance: 1%  [R0201]  (hidden comment: 0201)
R32  value 22R  Tolerance: 1%  [R0201]  (hidden comment: 0201)
R33  value 22R  Tolerance: 1%  [R0201]  (hidden comment: 0201)
R34  value 1k  Tolerance: 1%  [R0201]  (hidden comment: 0201)
R35  value 1k  Tolerance: 1%  [R0201]  (hidden comment: 0201)
R36  value 1k  Tolerance: 1%  [R0201]  (hidden comment: 0201)
R37  value 1k  Tolerance: 1%  [R0201]  (hidden comment: 0201)
R38  value 1k  Tolerance: 1%  [R0201]  (hidden comment: 0201)
R39  value 1k  Tolerance: 1%  [R0201]  (hidden comment: 0201)
R40  value 22R  Tolerance: 1%  [R0201]  (hidden comment: 0201)
R41  value 22R  Tolerance: 1%  [R0201]  (hidden comment: 0201)
R42  value 22R  Tolerance: 1%  [R0201]  (hidden comment: 0201)
R43  value 22R  Tolerance: 1%  [R0201]  (hidden comment: 0201)
R44  value 22R  Tolerance: 1%  [R0201]  (hidden comment: 0201)
R45  value 22R  Tolerance: 1%  [R0201]  (hidden comment: 0201)
R46  value 6k01  Tolerance: 1%  [R0201]  (hidden comment: 0201)
R47  value DNP  Tolerance: 1%  [R0201]  (hidden comment: 0201)
R48  value DNP  Tolerance: 1%  [R0201]  (hidden comment: 0201)
R49  value 10k  Tolerance: 1%  [R0201]  (hidden comment: 0201)
R50  value 10k  Tolerance: 1%  [R0201]  (hidden comment: 0201)
R51  value 10k  Tolerance: 1%  [R0201]  (hidden comment: 0201)
R52  value 10k  Tolerance: 1%  [R0201]  (hidden comment: 0201)
R53  value 22R  Tolerance: 1%  [R0201]  (hidden comment: 0201)
R54  value 1k  Tolerance: 1%  [R0201]  (hidden comment: 0201)
R55  value 1k  Tolerance: 1%  [R0201]  (hidden comment: 0201)
R56  value 1k  Tolerance: 1%  [R0201]  (hidden comment: 0201)
R57  value 1k  Tolerance: 1%  [R0201]  (hidden comment: 0201)
R58  value 1k  Tolerance: 1%  [R0201]  (hidden comment: 0201)
R59  value DNP  Tolerance: 1%  [R0201]  (hidden comment: 0201)
TP4  Testpoint 0.5mm  [TP_0.50mm]  (value not drawn)  (no BOM)
TP5  Testpoint 0.5mm  [TP_0.50mm]  (value not drawn)  (no BOM)
TP6  Testpoint 0.5mm  [TP_0.50mm]  (value not drawn)  (no BOM)
U4  LAN8840  [QFN-48-1EP_7x7mm_P0.5mm_EP5.15x5.15mm]
U5  TLV743P  [SOT-23-5]

### Ports
CLK125 (bidir, see SBC_SCH[6B]), CLK_IN (in, see SBC_SCH[5B]), ETH_MDI (harness ETH_MDI, see SBC_SCH[6B], ETH_Magjack[2B]), ETH_PHY_INT (in, see SBC_SCH[5C]), ETH_RGMII (harness ETH_RGMII, see SBC_SCH[5B], SoC_Interfaces[6C]), ~{ETH_PHY_RST} (in, see SBC_SCH[5B]), ~{RESETSTATz} (in, see SBC_SCH[5C])

### Harnesses
ETH_MDI: ETH_MDI_TR0_P, ETH_MDI_TR0_N, ETH_MDI_TR1_P, ETH_MDI_TR1_N, ETH_MDI_TR2_P, ETH_MDI_TR2_N, ETH_MDI_TR3_P, ETH_MDI_TR3_N
ETH_RGMII: ETH_RGMII_RXD0, ETH_RGMII_RXD1, ETH_RGMII_RXD2, ETH_RGMII_RXD3, ETH_RGMII_RXC, ETH_RGMII_RXCTL, ETH_RGMII_TXD0, ETH_RGMII_TXD1, ETH_RGMII_TXD2, ETH_RGMII_TXD3, ETH_RGMII_TXC, ETH_RGMII_TXCTL, ETH_RGMII_MDC, ETH_RGMII_MDIO

### Nets
+1V8_ETH: C37.1 C38.1 C39.1 C40.1 C41.1 C42.1 R19.1 R20.1 R21.1 R22.1 R23.1 R24.1 R25.1 R26.1 R27.1 R47.1 R48.1 R49.1 R50.1 R51.1 R52.1 U4.17(VDDIO) U4.24(VDDIO) U4.28(VDDIO) U4.35(VDDIO) U4.41(VDDIO)
+3V3_ETH: C50.1 FB3.2 U5.5(VOUT)
GND: C37.2 C38.2 C39.2 C40.2 C41.2 C42.2 C43.2 C44.2 C45.2 C46.2 C47.2 C48.2 C49.2 C50.2 C51.2 C52.2 C53.2 C54.2 R34.2 R35.2 R36.2 R37.2 R38.2 R39.2 R46.2 R54.2 R55.2 R56.2 R57.2 R58.2 R59.2 U4.49(EP) U5.2(GND) U5.3(EN)
+1V1_LDO: C46.1 C47.1 C48.1 C49.1 FB4.2 U4.4(VDDAL) U4.9(VDDAL) U4.47(VDDAL_PLL) U5.1(IN)
~{ETH_PHY_RST}: D2.1(K) ; port ~{ETH_PHY_RST}
~{RESET}: D1.2(A) D2.2(A) R26.2 TP6.TP U4.43(RESET_N)
~{RESETSTATz}: D1.1(K) ; port ~{RESETSTATz}
ETH_MDI_TR0_N: U4.3(TXRXM_A) ; port ETH_MDI.ETH_MDI_TR0_N
ETH_MDI_TR0_P: U4.2(TXRXP_A) ; port ETH_MDI.ETH_MDI_TR0_P
ETH_MDI_TR1_N: U4.6(TXRXM_B) ; port ETH_MDI.ETH_MDI_TR1_N
ETH_MDI_TR1_P: U4.5(TXRXP_B) ; port ETH_MDI.ETH_MDI_TR1_P
ETH_MDI_TR2_N: U4.8(TXRXM_C) ; port ETH_MDI.ETH_MDI_TR2_N
ETH_MDI_TR2_P: U4.7(TXRXP_C) ; port ETH_MDI.ETH_MDI_TR2_P
ETH_MDI_TR3_N: U4.11(TXRXM_D) ; port ETH_MDI.ETH_MDI_TR3_N
ETH_MDI_TR3_P: U4.10(TXRXP_D) ; port ETH_MDI.ETH_MDI_TR3_P
ETH_PHY_CLK_IN: TP5.TP U4.46(XI) ; port CLK_IN
ETH_PHY_INT: R25.2 TP4.TP U4.39(INT_N/GPIO5) ; port ETH_PHY_INT
ETH_PHY_ISET: R46.1 U4.48(ISET)
ETH_RGMII_MDC: U4.37(MDC) ; port ETH_RGMII.ETH_RGMII_MDC
ETH_RGMII_MDIO: R27.2 U4.38(MDIO) ; port ETH_RGMII.ETH_RGMII_MDIO
ETH_RGMII_RXC: R32.1 ; port ETH_RGMII.ETH_RGMII_RXC
ETH_RGMII_RXCTL: R33.1 ; port ETH_RGMII.ETH_RGMII_RXCTL
ETH_RGMII_RXD0: R28.1 ; port ETH_RGMII.ETH_RGMII_RXD0
ETH_RGMII_RXD1: R29.1 ; port ETH_RGMII.ETH_RGMII_RXD1
ETH_RGMII_RXD2: R30.1 ; port ETH_RGMII.ETH_RGMII_RXD2
ETH_RGMII_RXD3: R31.1 ; port ETH_RGMII.ETH_RGMII_RXD3
ETH_RGMII_TXC: R44.1 ; port ETH_RGMII.ETH_RGMII_TXC
ETH_RGMII_TXCTL: R45.1 ; port ETH_RGMII.ETH_RGMII_TXCTL
ETH_RGMII_TXD0: R40.1 ; port ETH_RGMII.ETH_RGMII_TXD0
ETH_RGMII_TXD1: R41.1 ; port ETH_RGMII.ETH_RGMII_TXD1
ETH_RGMII_TXD2: R42.1 ; port ETH_RGMII.ETH_RGMII_TXD2
ETH_RGMII_TXD3: R43.1 ; port ETH_RGMII.ETH_RGMII_TXD3
RGMII_RXC: R20.2 R32.2 R35.1 U4.36(RXC/MODE4)
RGMII_RXCTL: R19.2 R33.2 R34.1 U4.34(RX_CTL/CLK125_EN)
RGMII_RXD0: R24.2 R28.2 R39.1 U4.33(RXD0/MODE0)
RGMII_RXD1: R23.2 R29.2 R38.1 U4.32(RXD1/MODE1)
RGMII_RXD2: R22.2 R30.2 R37.1 U4.30(RXD2/MODE2)
RGMII_RXD3: R21.2 R31.2 R36.1 U4.29(RXD3/MODE3)
RGMII_TXC: R44.2 U4.25(TXC)
RGMII_TXCTL: R45.2 U4.26(TX_CTL)
RGMII_TXD0: R40.2 U4.19(TXD0)
RGMII_TXD1: R41.2 U4.20(TXD1)
RGMII_TXD2: R42.2 U4.21(TXD2)
RGMII_TXD3: R43.2 U4.22(TXD3)
NetC43_1: C43.1 C44.1 C45.1 FB3.1 U4.1(VDDAH) U4.12(VDDAH)
NetC51_1: C51.1 C52.1 C53.1 C54.1 FB4.1 U4.23(VDD) U4.27(VDD) U4.31(VDD) U4.40(VDD)
NetR47_2: R47.2 R54.1 U4.13(LED5/GPIO4/ALLPHYAD/LEDPOL5)
NetR48_2: R48.2 R55.1 U4.14(LED4/GPIO3/MAGJACK/LEDPOL4)
NetR49_2: R49.2 R56.1 U4.18(LED1/GPIO0/PHYAD0/LEDPOL1)
NetR50_2: R50.2 R57.1 U4.16(LED2/GPIO1/PHYAD1/LEDPOL2)
NetR51_2: R51.2 R58.1 U4.15(LED3/GPIO2/PHYAD2/LEDPOL3)
NetR52_2: R52.2 R53.2 R59.1 U4.42(CLK125_NDO/GPIO6/LED_MODE)
NetR53_1: R53.1 ; port CLK125

Not connected (* = marked no-connect by the designer): U4 44(LDO_O)* 45(XO)*; U5 4(NC)*

### Layout directives
differential pair; differential pair class DIFF100: ETH_MDI_TR0_N, ETH_MDI_TR0_P, ETH_MDI_TR1_N, ETH_MDI_TR1_P, ETH_MDI_TR2_N, ETH_MDI_TR2_P, ETH_MDI_TR3_N, ETH_MDI_TR3_P

### Notes on the sheet
- (in symbol C_0201) 0201
- (in symbol C_0402) 0402

### Library data of the parts
C37-C41 C43 C44 C46-C48 C51-C54 = C_0201: MLCC 0201; Manufacturer_Name: *; Manufacturer_Part_Number: *
C42 C45 C49 C50 = C_0402: MLCC 0402; Manufacturer_Name: *; Manufacturer_Part_Number: *
D1 D2 = D_Filled: Diode, filled shape; Sim.Device: D; Sim.Pins: 1=K 2=A; Value: *; Manufacturer_Name: *; Manufacturer Part Number: *
FB3 FB4 = FB_0201: Ferrite bead; Parameter 1: *
R19-R59 = R_0201: Manufacturer_Name: *; Manufacturer_Part_Number: *
U4 = LAN8840: Gigabit Ethernet Transceiver with RGMII Interface and IEEE 1588v2 Support, VQFN-48; KiCad_Footprint: Package_DFN_QFN:QFN-48-1EP_7x7mm_P0.5mm_EP5.15x5.15mm; Datasheet: https://ww1.microchip.com/downloads/aemDocuments/documents/UNG/ProductDocuments/DataSheets/LAN8840-Data-Sheet-DS00004727.pdf; ComponentLink1Description: Datasheet; ComponentLink1URL: https://ww1.microchip.com/downloads/aemDocuments/documents/UNG/ProductDocuments/DataSheets/LAN8840-Data-Sheet-DS00004727.pdf; Manufacturer_Name: *; Manufacturer_Part_Number: *
U5 = TLV743P: Linear Voltage Regulator IC Positive Fixed 1 Output 300mA SOT-23-5; Manufacturer_Name: Texas Instruments; Manufacturer_Part_Number: TLV74311PDBVR; Value: TLV74311PDBVR

## Sheet 16_ETH_Magjack.SchDoc
size A3; SheetNumber: 6; SheetTotal: 20
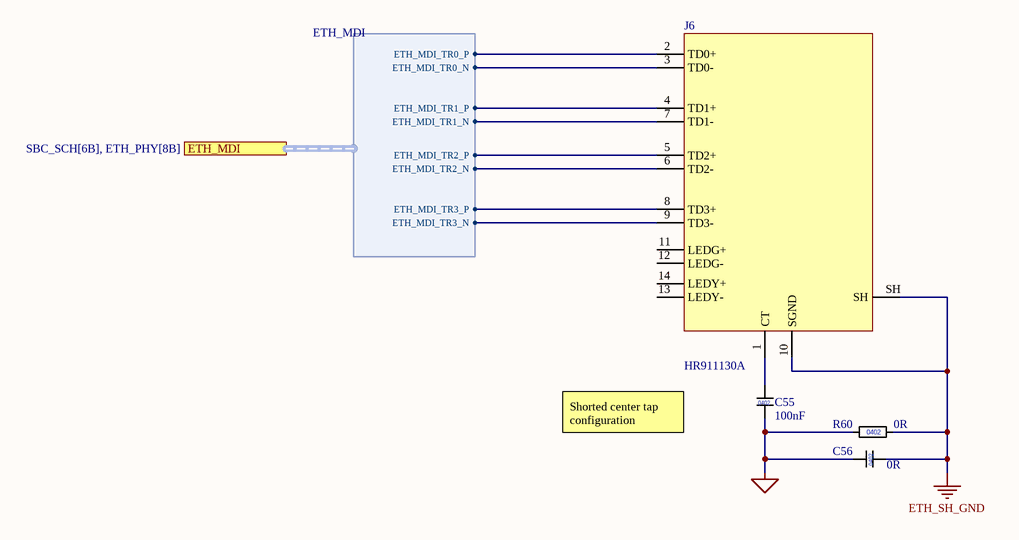
[diagram p5: 16_ETH_Magjack.SchDoc]

### Parts
C55  value 100nF  [C0402]  (hidden comment: C_0402)
C56  value 0R  [C0402]  (hidden comment: C_0402)
J6  HR911130A  [HR911130A]
R60  value 0R  [R0402]  (hidden comment: 0402)

### Ports
ETH_MDI (harness ETH_MDI, see SBC_SCH[6B], ETH_PHY[8B])

### Harnesses
ETH_MDI: ETH_MDI_TR0_P, ETH_MDI_TR0_N, ETH_MDI_TR1_P, ETH_MDI_TR1_N, ETH_MDI_TR2_P, ETH_MDI_TR2_N, ETH_MDI_TR3_P, ETH_MDI_TR3_N

### Nets
ETH_SH_GND: C56.2 J6.10(SGND) J6.SH R60.R?
GND: C55.2 C56.1 R60.1
ETH_MDI_TR0_N: J6.3(TD0-) ; port ETH_MDI.ETH_MDI_TR0_N
ETH_MDI_TR0_P: J6.2(TD0+) ; port ETH_MDI.ETH_MDI_TR0_P
ETH_MDI_TR1_N: J6.7(TD1-) ; port ETH_MDI.ETH_MDI_TR1_N
ETH_MDI_TR1_P: J6.4(TD1+) ; port ETH_MDI.ETH_MDI_TR1_P
ETH_MDI_TR2_N: J6.6(TD2-) ; port ETH_MDI.ETH_MDI_TR2_N
ETH_MDI_TR2_P: J6.5(TD2+) ; port ETH_MDI.ETH_MDI_TR2_P
ETH_MDI_TR3_N: J6.9(TD3-) ; port ETH_MDI.ETH_MDI_TR3_N
ETH_MDI_TR3_P: J6.8(TD3+) ; port ETH_MDI.ETH_MDI_TR3_P
NetC55_1: C55.1 J6.1(CT)

Not connected (* = marked no-connect by the designer): J6 11(LEDG+) 12(LEDG-) 13(LEDY-) 14(LEDY+)

### Notes on the sheet
- Shorted center tap configuration
- (in symbol C_0402) 0402

### Library data of the parts
C55 C56 = C_0402: MLCC 0402; Manufacturer_Name: *; Manufacturer_Part_Number: *
J6 = HR911130A: 1 port RJ45 MagJack GIGABIT Right Angle Shielded With Contact Spring With LED; Manufacturer_Name: HANRUN(Zhongshan HanRun Elec); Manufacturer_Part_Number: HR915350C; Height: 13.55
R60 = R_0402: Tolerance: 1%; Manufacturer_Name: *; Manufacturer_Part_Number: *

## Sheet 14_DC_Reg_PMIC.SchDoc
size A3; SheetNumber: 7; SheetTotal: 21
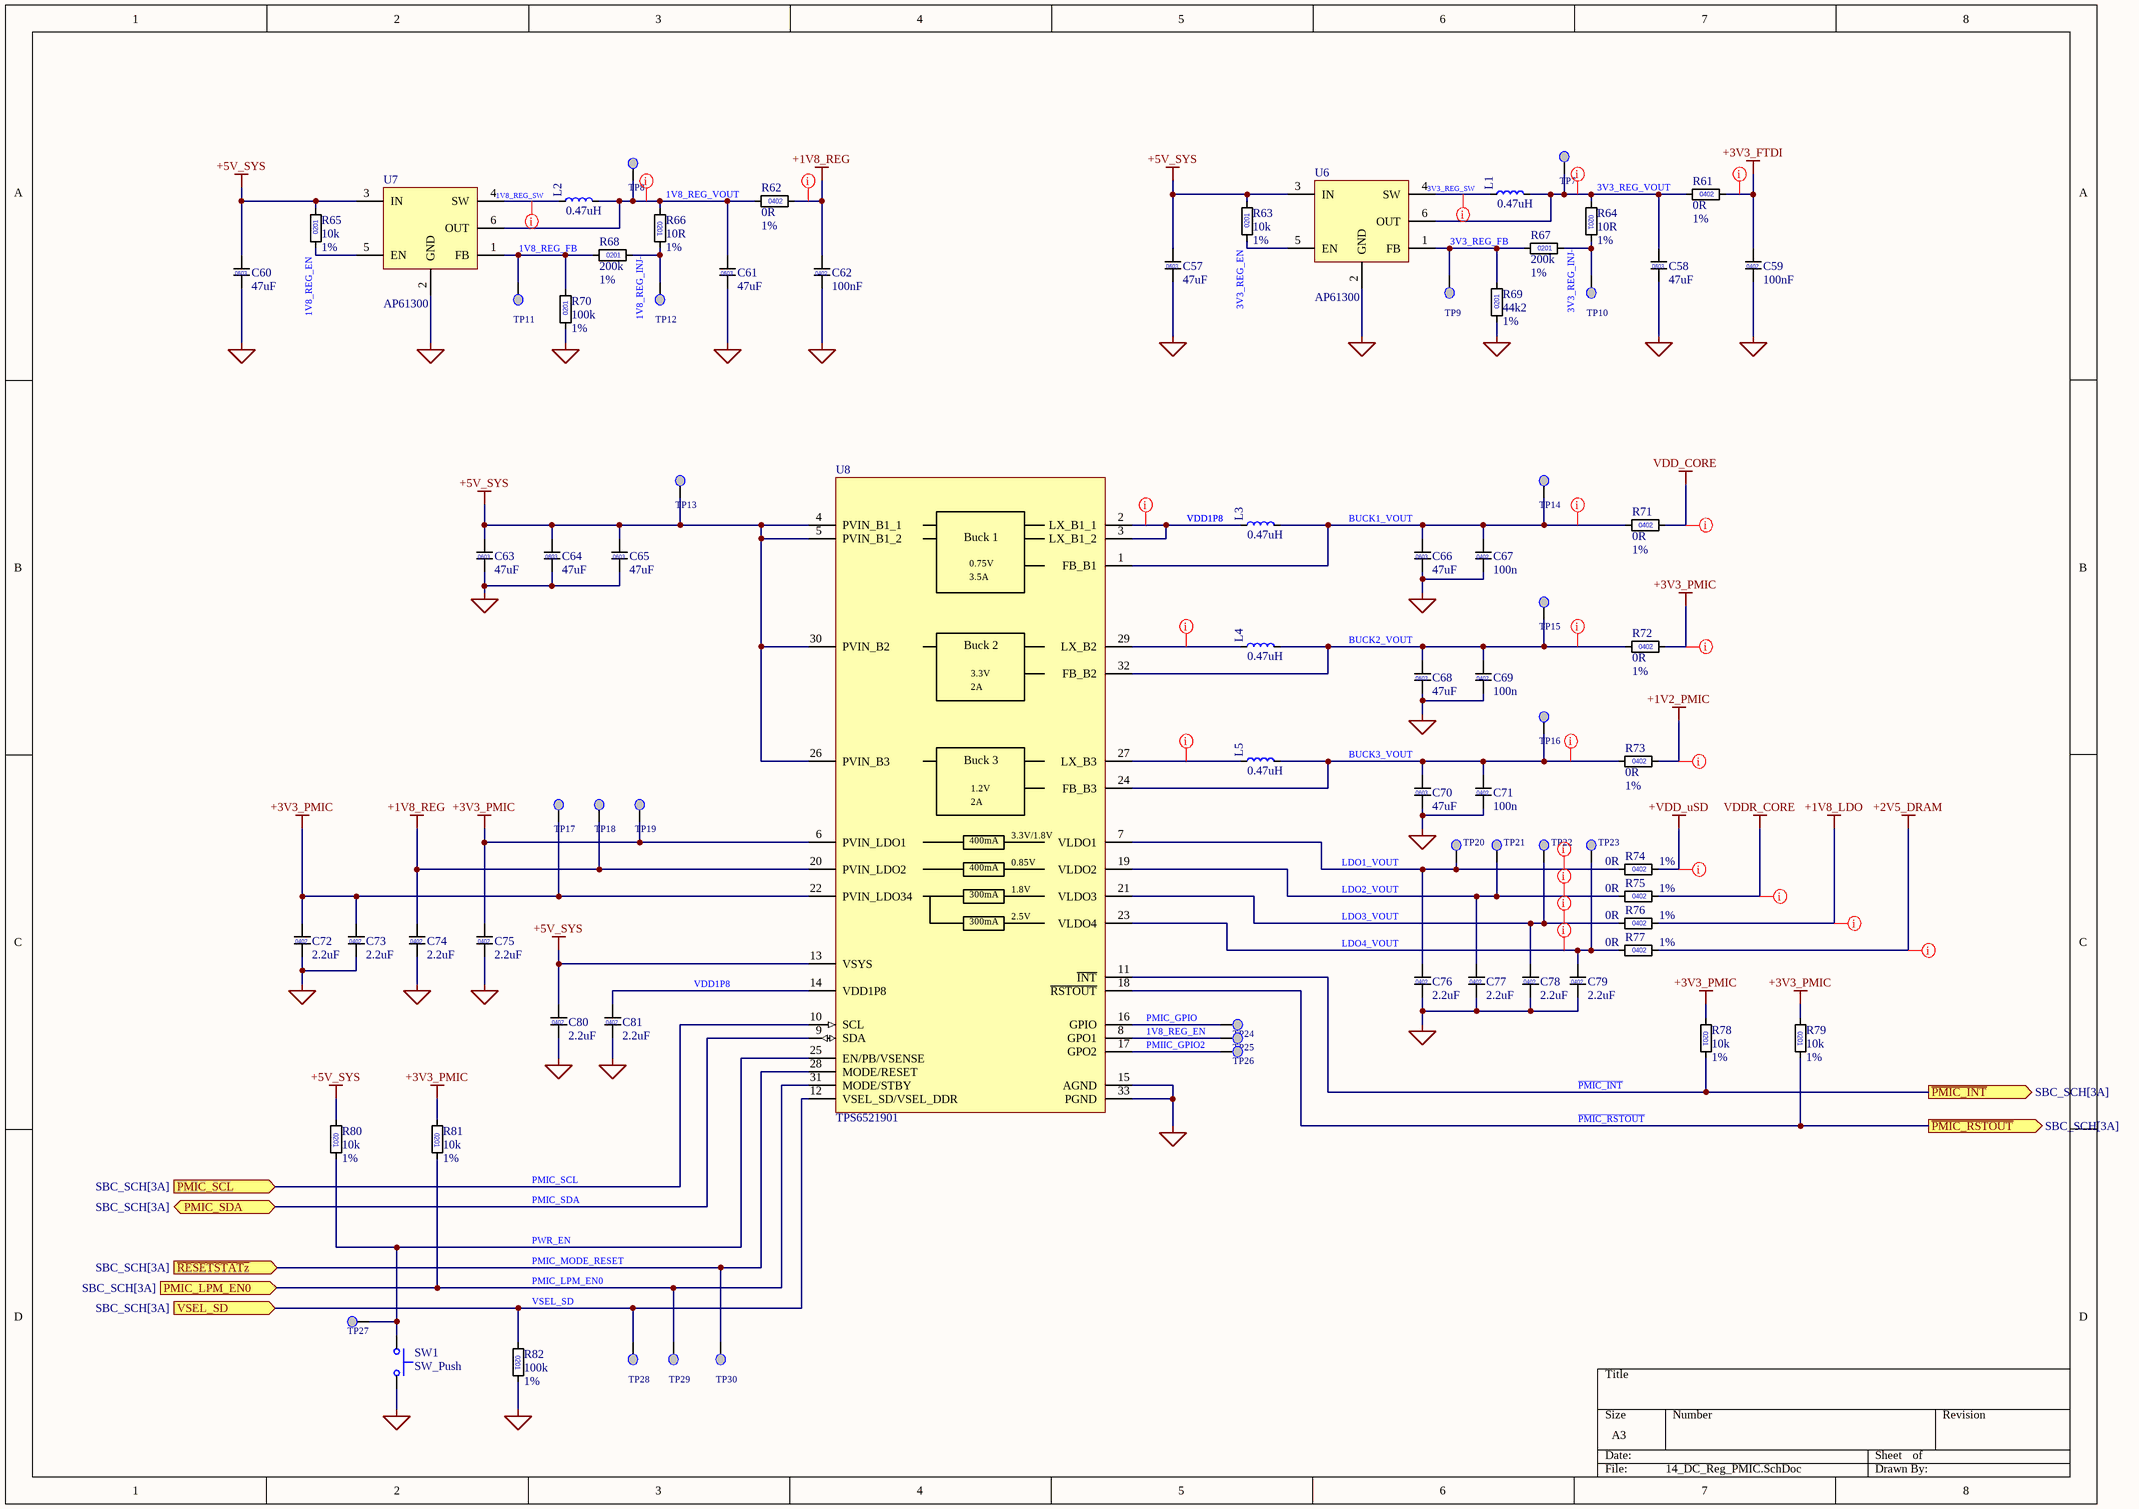
[diagram p6: 14_DC_Reg_PMIC.SchDoc]

### Parts
C57  value 47uF  (hidden comment: C_0603)
C58  value 47uF  (hidden comment: C_0603)
C59  value 100nF  [C0402]  (hidden comment: C_0402)
C60  value 47uF  (hidden comment: C_0603)
C61  value 47uF  (hidden comment: C_0603)
C62  value 100nF  [C0402]  (hidden comment: C_0402)
C63  value 47uF  (hidden comment: C_0603)
C64  value 47uF  (hidden comment: C_0603)
C65  value 47uF  (hidden comment: C_0603)
C66  value 47uF  (hidden comment: C_0603)
C67  value 100n  [C0402]  (hidden comment: C_0402)
C68  value 47uF  (hidden comment: C_0603)
C69  value 100n  [C0402]  (hidden comment: C_0402)
C70  value 47uF  (hidden comment: C_0603)
C71  value 100n  [C0402]  (hidden comment: C_0402)
C72  value 2.2uF  [C0402]  (hidden comment: C_0402)
C73  value 2.2uF  [C0402]  (hidden comment: C_0402)
C74  value 2.2uF  [C0402]  (hidden comment: C_0402)
C75  value 2.2uF  [C0402]  (hidden comment: C_0402)
C76  value 2.2uF  [C0402]  (hidden comment: C_0402)
C77  value 2.2uF  [C0402]  (hidden comment: C_0402)
C78  value 2.2uF  [C0402]  (hidden comment: C_0402)
C79  value 2.2uF  [C0402]  (hidden comment: C_0402)
C80  value 2.2uF  [C0402]  (hidden comment: C_0402)
C81  value 2.2uF  [C0402]  (hidden comment: C_0402)
L1  value 0.47uH  (hidden comment: L)
L2  value 0.47uH  (hidden comment: L)
L3  value 0.47uH  (hidden comment: L)
L4  value 0.47uH  (hidden comment: L)
L5  value 0.47uH  (hidden comment: L)
R61  value 0R  Tolerance: 1%  [R0402]  (hidden comment: 0402)
R62  value 0R  Tolerance: 1%  [R0402]  (hidden comment: 0402)
R63  value 10k  Tolerance: 1%  [R0201]  (hidden comment: 0201)
R64  value 10R  Tolerance: 1%  [R0201]  (hidden comment: 0201)
R65  value 10k  Tolerance: 1%  [R0201]  (hidden comment: 0201)
R66  value 10R  Tolerance: 1%  [R0201]  (hidden comment: 0201)
R67  value 200k  Tolerance: 1%  [R0201]  (hidden comment: 0201)
R68  value 200k  Tolerance: 1%  [R0201]  (hidden comment: 0201)
R69  value 44k2  Tolerance: 1%  [R0201]  (hidden comment: 0201)
R70  value 100k  Tolerance: 1%  [R0201]  (hidden comment: 0201)
R71  value 0R  Tolerance: 1%  [R0402]  (hidden comment: 0402)
R72  value 0R  Tolerance: 1%  [R0402]  (hidden comment: 0402)
R73  value 0R  Tolerance: 1%  [R0402]  (hidden comment: 0402)
R74  value 0R  Tolerance: 1%  [R0402]  (hidden comment: 0402)
R75  value 0R  Tolerance: 1%  [R0402]  (hidden comment: 0402)
R76  value 0R  Tolerance: 1%  [R0402]  (hidden comment: 0402)
R77  value 0R  Tolerance: 1%  [R0402]  (hidden comment: 0402)
R78  value 10k  Tolerance: 1%  [R0201]  (hidden comment: 0201)
R79  value 10k  Tolerance: 1%  [R0201]  (hidden comment: 0201)
R80  value 10k  Tolerance: 1%  [R0201]  (hidden comment: 0201)
R81  value 10k  Tolerance: 1%  [R0201]  (hidden comment: 0201)
R82  value 100k  Tolerance: 1%  [R0201]  (hidden comment: 0201)
SW1  SW_Push
TP7  Testpoint 0.5mm  [TP_0.50mm]  (value not drawn)  (no BOM)
TP8  Testpoint 0.5mm  [TP_0.50mm]  (value not drawn)  (no BOM)
TP9  Testpoint 0.5mm  [TP_0.50mm]  (value not drawn)  (no BOM)
TP10  Testpoint 0.5mm  [TP_0.50mm]  (value not drawn)  (no BOM)
TP11  Testpoint 0.5mm  [TP_0.50mm]  (value not drawn)  (no BOM)
TP12  Testpoint 0.5mm  [TP_0.50mm]  (value not drawn)  (no BOM)
TP13  Testpoint 0.5mm  [TP_0.50mm]  (value not drawn)  (no BOM)
TP14  Testpoint 0.5mm  [TP_0.50mm]  (value not drawn)  (no BOM)
TP15  Testpoint 0.5mm  [TP_0.50mm]  (value not drawn)  (no BOM)
TP16  Testpoint 0.5mm  [TP_0.50mm]  (value not drawn)  (no BOM)
TP17  Testpoint 0.5mm  [TP_0.50mm]  (value not drawn)  (no BOM)
TP18  Testpoint 0.5mm  [TP_0.50mm]  (value not drawn)  (no BOM)
TP19  Testpoint 0.5mm  [TP_0.50mm]  (value not drawn)  (no BOM)
TP20  Testpoint 0.5mm  [TP_0.50mm]  (value not drawn)  (no BOM)
TP21  Testpoint 0.5mm  [TP_0.50mm]  (value not drawn)  (no BOM)
TP22  Testpoint 0.5mm  [TP_0.50mm]  (value not drawn)  (no BOM)
TP23  Testpoint 0.5mm  [TP_0.50mm]  (value not drawn)  (no BOM)
TP24  Testpoint 0.5mm  [TP_0.50mm]  (value not drawn)  (no BOM)
TP25  Testpoint 0.5mm  [TP_0.50mm]  (value not drawn)  (no BOM)
TP26  Testpoint 0.5mm  [TP_0.50mm]  (value not drawn)  (no BOM)
TP27  Testpoint 0.5mm  [TP_0.50mm]  (value not drawn)  (no BOM)
TP28  Testpoint 0.5mm  [TP_0.50mm]  (value not drawn)  (no BOM)
TP29  Testpoint 0.5mm  [TP_0.50mm]  (value not drawn)  (no BOM)
TP30  Testpoint 0.5mm  [TP_0.50mm]  (value not drawn)  (no BOM)
U6  AP61300  [SOT563]
U7  AP61300  [SOT563]
U8  TPS6521901  [QFN-32-1EP_5x5mm_P0.5mm_EP3.7x3.7mm]

### Ports
PMIC_LPM_EN0 (in, see SBC_SCH[3A]), PMIC_SCL (in, see SBC_SCH[3A]), PMIC_SDA (bidir, see SBC_SCH[3A]), VSEL_SD (in, see SBC_SCH[3A]), ~{PMIC_INT} (out, see SBC_SCH[3A]), ~{PMIC_RSTOUT} (out, see SBC_SCH[3A]), ~{RESETSTATz} (in, see SBC_SCH[3A])

### Nets
+1V2_PMIC: R73.2
+1V8_LDO: R76.2
+1V8_REG: C62.1 C74.1 R62.2 TP18.TP U8.20(PVIN_LDO2)
+2V5_DRAM: R77.2
+3V3_FTDI: C59.1 R61.2
+3V3_PMIC: C72.1 C73.1 C75.1 R72.2 R78.1 R79.1 R81.1 TP17.TP TP19.TP U8.6(PVIN_LDO1) U8.22(PVIN_LDO34)
+5V_SYS: C57.1 C60.1 C63.1 C64.1 C65.1 C80.1 R63.2 R65.2 R80.1 TP13.TP U6.3(IN) U7.3(IN) U8.4(PVIN_B1_1) U8.5(PVIN_B1_2) U8.13(VSYS) U8.26(PVIN_B3) U8.30(PVIN_B2)
+VDD_uSD: R74.2
GND: C57.2 C58.2 C59.2 C60.2 C61.2 C62.2 C63.2 C64.2 C65.2 C66.2 C67.2 C68.2 C69.2 C70.2 C71.2 C72.2 C73.2 C74.2 C75.2 C76.2 C77.2 C78.2 C79.2 C80.2 C81.2 R69.1 R70.1 R82.2 SW1.1 U6.2(GND) U7.2(GND) U8.15(AGND) U8.33(PGND)
VDD_CORE: R71.2
VDDR_CORE: R75.2
1V8_REG_EN: R65.1 TP25.TP U7.5(EN) U8.8(GPO1)
1V8_REG_FB: R68.1 R70.2 TP11.TP U7.1(FB)
1V8_REG_INJ-: R66.2 R68.2 TP12.TP
1V8_REG_SW: L2.1 U7.4(SW)
1V8_REG_VOUT: C61.1 L2.2 R62.1 R66.1 TP8.TP U7.6(OUT)
3V3_REG_EN: R63.1 U6.5(EN)
3V3_REG_FB: R67.1 R69.2 TP9.TP U6.1(FB)
3V3_REG_INJ-: R64.2 R67.2 TP10.TP
3V3_REG_SW: L1.1 U6.4(SW)
3V3_REG_VOUT: C58.1 L1.2 R61.1 R64.1 TP7.TP U6.6(OUT)
~{PMIC_INT}: R78.2 U8.11(~{INT}) ; port ~{PMIC_INT}
~{PMIC_RSTOUT}: R79.2 U8.18(~{RSTOUT}) ; port ~{PMIC_RSTOUT}
BUCK1_VOUT: C66.1 C67.1 L3.2 R71.1 TP14.TP U8.1(FB_B1)
BUCK2_VOUT: C68.1 C69.1 L4.2 R72.1 TP15.TP U8.32(FB_B2)
BUCK3_VOUT: C70.1 C71.1 L5.2 R73.1 TP16.TP U8.24(FB_B3)
LDO1_VOUT: C76.1 R74.1 TP20.TP U8.7(VLDO1)
LDO2_VOUT: C77.1 R75.1 TP21.TP U8.19(VLDO2)
LDO3_VOUT: C78.1 R76.1 TP22.TP U8.21(VLDO3)
LDO4_VOUT: C79.1 R77.1 TP23.TP U8.23(VLDO4)
PMIC_GPIO: TP24.TP U8.16(GPIO)
PMIC_LPM_EN0: R81.2 TP29.TP U8.31(MODE/STBY) ; port PMIC_LPM_EN0
PMIC_MODE_RESET: TP30.TP U8.28(MODE/RESET) ; port ~{RESETSTATz}
PMIC_SCL: U8.10(SCL) ; port PMIC_SCL
PMIC_SDA: U8.9(SDA) ; port PMIC_SDA
PMIIC_GPIO2: TP26.TP U8.17(GPO2)
PWR_EN: R80.2 SW1.2 TP27.TP U8.25(EN/PB/VSENSE)
VDD1P8: C81.1 L3.1 U8.2(LX_B1_1) U8.3(LX_B1_2) U8.14(VDD1P8)
VSEL_SD: R82.1 TP28.TP U8.12(VSEL_SD/VSEL_DDR) ; port VSEL_SD
NetL4_1: L4.1 U8.29(LX_B2)
NetL5_1: L5.1 U8.27(LX_B3)

### Layout directives
net class PWR: 1V8_REG_SW, 1V8_REG_VOUT, 3V3_REG_SW, 3V3_REG_VOUT, +1V2_PMIC, +1V8_LDO, +1V8_REG, +2V5_DRAM, +3V3_FTDI, +3V3_PMIC, +VDD_uSD, BUCK1_VOUT, BUCK2_VOUT, BUCK3_VOUT, LDO1_VOUT, LDO2_VOUT, LDO3_VOUT, LDO4_VOUT, NetL4_1, NetL5_1, VDD1P8, VDD_CORE, VDDR_CORE

### Notes on the sheet
- (in symbol C_0402) 0402
- (in symbol C_0603) 0603
- (in symbol TPS6521901RSMR) Buck 1; 0.75V; 3.5A; Buck 2; 3.3V; 2A; Buck 3; 1.2V; 3.3V/1.8V; 400mA; 0.85V; 1.8V; 300mA; 2.5V

### Library data of the parts
C57 C58 C60 C61 C63-C66 C68 C70 = C_0603: MLCC 0603; Manufacturer_Name: *; Manufacturer_Part_Number: *
C59 C62 C67 C69 C71-C81 = C_0402: MLCC 0402; Manufacturer_Name: *; Manufacturer_Part_Number: *
L1-L5 = L_0806: Inductor; Manufacturer_Name: *; Manufacturer_Part_Number: *
R61 R62 R71-R77 = R_0402: Manufacturer_Name: *; Manufacturer_Part_Number: *
R63-R70 R78-R82 = R_0201: Manufacturer_Name: *; Manufacturer_Part_Number: *
SW1 = SW_Push: Push button switch, generic, two pins
U6 U7 = AP61300: Buck Switching Regulator IC Positive Adjustable 0.6V 1 Output 3A SOT-563; Manufacturer_Name: Diodes Incorporated; Manufacturer_Part_Number: AP61300Z6-7; Value: AP61300
U8 = TPS6521901RSMR: PMIC, 3 bucks + 4 LDOs, I2C, NVM 07, 4x4mm RHB VQFN-32 plus exposed PGND pad 33; MPN: TPS6521901RSMR; Footprint_Note: Generic footprint candidate: 5x5mm, 0.5mm pitch, EP3.7mm. Exists locally; pad lengths differ from TI RHB0032W recommended land pattern. Review before PCB fabrication.; Datasheet: https://www.ti.com/lit/ds/symlink/tps65219.pdf; ComponentLink1Description: Datasheet; ComponentLink1URL: https://www.ti.com/lit/ds/symlink/tps65219.pdf

## Sheet 21_WIFI_BLE_Module.SchDoc
size A3; SheetNumber: 8; SheetTotal: 21
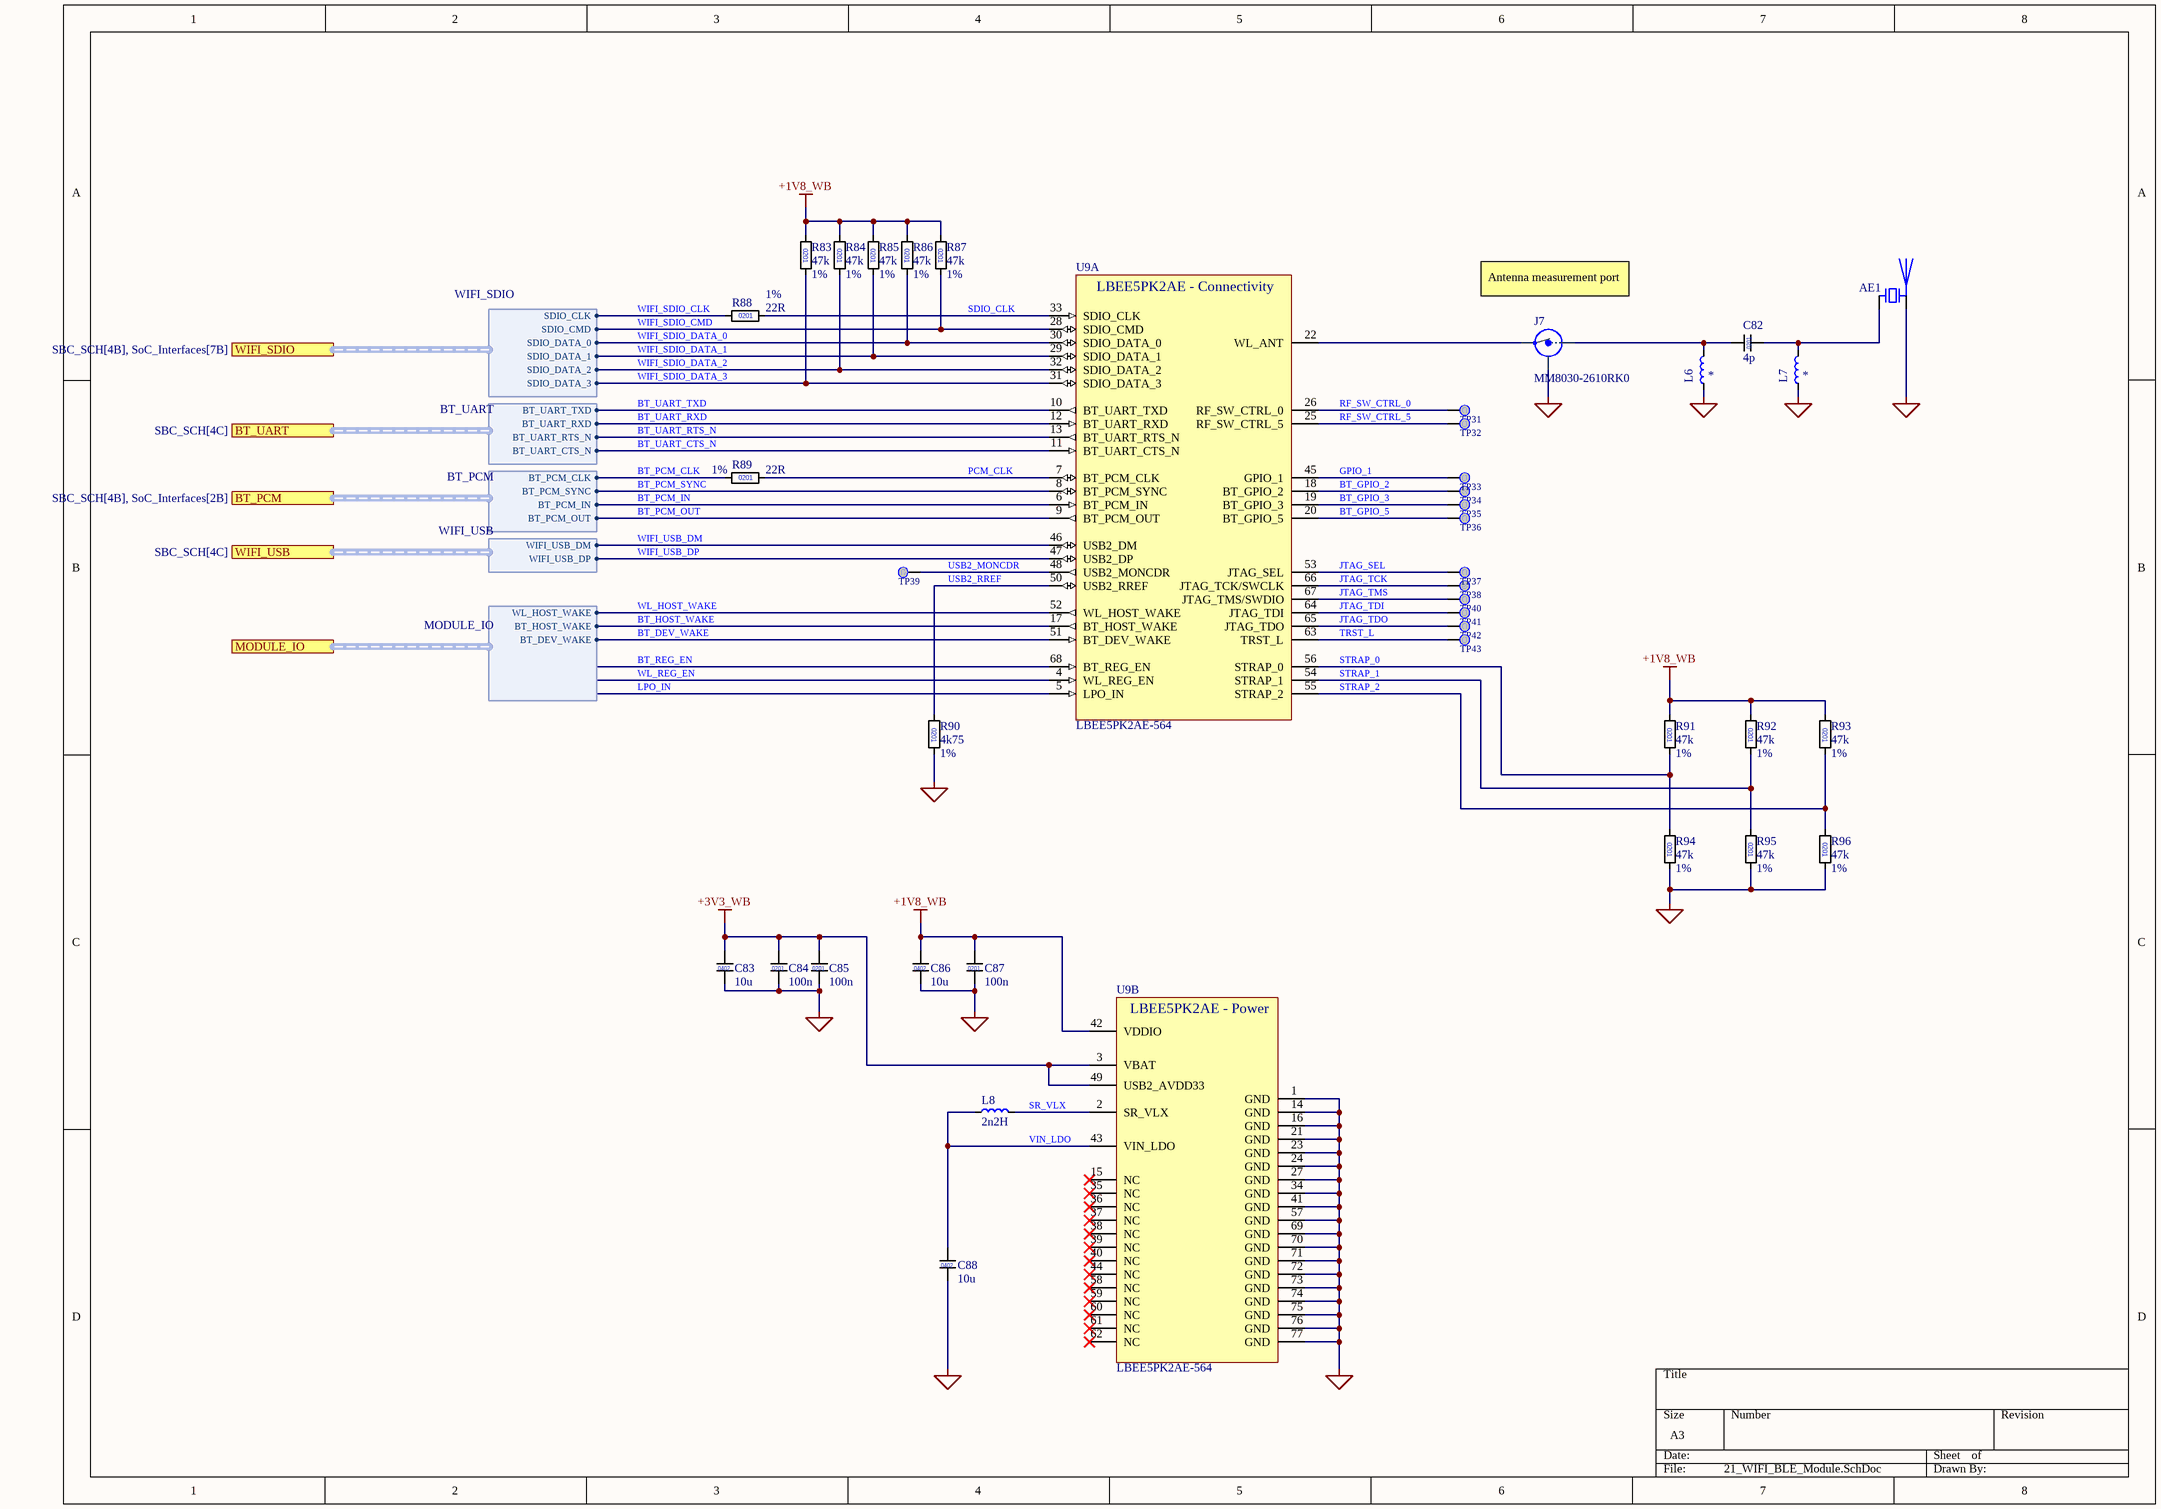
[diagram p7: 21_WIFI_BLE_Module.SchDoc]

### Parts
AE1  Antenna_Chip  [2450AD14A5500001T]  (value not drawn)
C82  value 4p  [C0201]  (hidden comment: C_0201)
C83  value 10u  [C0402]  (hidden comment: 4u7)
C84  value 100n  [C0201]  (hidden comment: C_0201)
C85  value 100n  [C0201]  (hidden comment: C_0201)
C86  value 10u  [C0402]  (hidden comment: 4u7)
C87  value 100n  [C0201]  (hidden comment: C_0201)
C88  value 10u  [C0402]  (hidden comment: 4u7)
J7  MM8030-2610RK0  [COAXIAL-SWG]
L6  L  [FB0201]  (value not drawn)
L7  L  [FB0201]  (value not drawn)
L8  value 2n2H  (hidden comment: L)
R83  value 47k  Tolerance: 1%  [R0201]  (hidden comment: 0201)
R84  value 47k  Tolerance: 1%  [R0201]  (hidden comment: 0201)
R85  value 47k  Tolerance: 1%  [R0201]  (hidden comment: 0201)
R86  value 47k  Tolerance: 1%  [R0201]  (hidden comment: 0201)
R87  value 47k  Tolerance: 1%  [R0201]  (hidden comment: 0201)
R88  value 22R  Tolerance: 1%  [R0201]  (hidden comment: 0201)
R89  value 22R  Tolerance: 1%  [R0201]  (hidden comment: 0201)
R90  value 4k75  Tolerance: 1%  [R0201]  (hidden comment: 0201)
R91  value 47k  Tolerance: 1%  [R0201]  (hidden comment: 0201)
R92  value 47k  Tolerance: 1%  [R0201]  (hidden comment: 0201)
R93  value 47k  Tolerance: 1%  [R0201]  (hidden comment: 0201)
R94  value 47k  Tolerance: 1%  [R0201]  (hidden comment: 0201)
R95  value 47k  Tolerance: 1%  [R0201]  (hidden comment: 0201)
R96  value 47k  Tolerance: 1%  [R0201]  (hidden comment: 0201)
TP31  Testpoint 0.5mm  [TP_0.50mm]  (value not drawn)  (no BOM)
TP32  Testpoint 0.5mm  [TP_0.50mm]  (value not drawn)  (no BOM)
TP33  Testpoint 0.5mm  [TP_0.50mm]  (value not drawn)  (no BOM)
TP34  Testpoint 0.5mm  [TP_0.50mm]  (value not drawn)  (no BOM)
TP35  Testpoint 0.5mm  [TP_0.50mm]  (value not drawn)  (no BOM)
TP36  Testpoint 0.5mm  [TP_0.50mm]  (value not drawn)  (no BOM)
TP37  Testpoint 0.5mm  [TP_0.50mm]  (value not drawn)  (no BOM)
TP38  Testpoint 0.5mm  [TP_0.50mm]  (value not drawn)  (no BOM)
TP39  Testpoint 0.5mm  [TP_0.50mm]  (value not drawn)  (no BOM)
TP40  Testpoint 0.5mm  [TP_0.50mm]  (value not drawn)  (no BOM)
TP41  Testpoint 0.5mm  [TP_0.50mm]  (value not drawn)  (no BOM)
TP42  Testpoint 0.5mm  [TP_0.50mm]  (value not drawn)  (no BOM)
TP43  Testpoint 0.5mm  [TP_0.50mm]  (value not drawn)  (no BOM)
U9  LBEE5PK2AE-564  [LBEE5PK2AE-564]  (parts A,B of 2)

### Ports
BT_PCM (harness BT_PCM, see SBC_SCH[4B], SoC_Interfaces[2B]), BT_UART (harness BT_UART, see SBC_SCH[4C]), MODULE_IO (harness MODULE_IO), WIFI_SDIO (harness WIFI_SDIO, see SBC_SCH[4B], SoC_Interfaces[7B]), WIFI_USB (harness WIFI_USB, see SBC_SCH[4C])

### Harnesses
WIFI_SDIO: SDIO_DATA_0, SDIO_DATA_1, SDIO_DATA_2, SDIO_DATA_3, SDIO_CLK, SDIO_CMD
BT_UART: BT_UART_TXD, BT_UART_RXD, BT_UART_RTS_N, BT_UART_CTS_N
BT_PCM: BT_PCM_CLK, BT_PCM_SYNC, BT_PCM_IN, BT_PCM_OUT
WIFI_USB: WIFI_USB_DM, WIFI_USB_DP
MODULE_IO: WL_HOST_WAKE, BT_HOST_WAKE, BT_DEV_WAKE

### Nets
+1V8_WB: C86.1 C87.1 R83.1 R84.1 R85.1 R86.1 R87.1 R91.1 R92.1 R93.1 U9.42(VDDIO)
+3V3_WB: C83.1 C84.1 C85.1 U9.3(VBAT) U9.49(USB2_AVDD33)
GND: AE1.1(GND) C83.2 C84.2 C85.2 C86.2 C87.2 C88.2 J7.2,4(GND) L6.1 L7.1 R90.2 R94.2 R95.2 R96.2 U9.1(GND) U9.14(GND) U9.16(GND) U9.21(GND) U9.23(GND) U9.24(GND) U9.27(GND) U9.34(GND) U9.41(GND) U9.57(GND) U9.69(GND) U9.70(GND) U9.71(GND) U9.72(GND) U9.73(GND) U9.74(GND) U9.75(GND) U9.76(GND) U9.77(GND)
BT_DEV_WAKE: U9.51(BT_DEV_WAKE) ; port MODULE_IO.BT_DEV_WAKE
BT_GPIO_2: TP34.TP U9.18(BT_GPIO_2)
BT_GPIO_3: TP35.TP U9.19(BT_GPIO_3)
BT_GPIO_5: TP36.TP U9.20(BT_GPIO_5)
BT_HOST_WAKE: U9.17(BT_HOST_WAKE) ; port MODULE_IO.BT_HOST_WAKE
BT_PCM_CLK: R89.1 ; port BT_PCM.BT_PCM_CLK
BT_PCM_IN: U9.6(BT_PCM_IN) ; port BT_PCM.BT_PCM_IN
BT_PCM_OUT: U9.9(BT_PCM_OUT) ; port BT_PCM.BT_PCM_OUT
BT_PCM_SYNC: U9.8(BT_PCM_SYNC) ; port BT_PCM.BT_PCM_SYNC
BT_REG_EN: U9.68(BT_REG_EN)
BT_UART_CTS_N: U9.11(BT_UART_CTS_N) ; port BT_UART.BT_UART_CTS_N
BT_UART_RTS_N: U9.13(BT_UART_RTS_N) ; port BT_UART.BT_UART_RTS_N
BT_UART_RXD: U9.12(BT_UART_RXD) ; port BT_UART.BT_UART_RXD
BT_UART_TXD: U9.10(BT_UART_TXD) ; port BT_UART.BT_UART_TXD
GPIO_1: TP33.TP U9.45(GPIO_1)
JTAG_SEL: TP37.TP U9.53(JTAG_SEL)
JTAG_TCK: TP38.TP U9.66(JTAG_TCK/SWCLK)
JTAG_TDI: TP41.TP U9.64(JTAG_TDI)
JTAG_TDO: TP42.TP U9.65(JTAG_TDO)
JTAG_TMS: TP40.TP U9.67(JTAG_TMS/SWDIO)
LPO_IN: U9.5(LPO_IN)
PCM_CLK: R89.2 U9.7(BT_PCM_CLK)
RF_SW_CTRL_0: TP31.TP U9.26(RF_SW_CTRL_0)
RF_SW_CTRL_5: TP32.TP U9.25(RF_SW_CTRL_5)
SDIO_CLK: R88.2 U9.33(SDIO_CLK)
SR_VLX: L8.2 U9.2(SR_VLX)
STRAP_0: R91.2 R94.1 U9.56(STRAP_0)
STRAP_1: R92.2 R95.1 U9.54(STRAP_1)
STRAP_2: R93.2 R96.1 U9.55(STRAP_2)
TRST_L: TP43.TP U9.63(TRST_L)
USB2_MONCDR: TP39.TP U9.48(USB2_MONCDR)
USB2_RREF: R90.1 U9.50(USB2_RREF)
VIN_LDO: C88.1 L8.1 U9.43(VIN_LDO)
WIFI_SDIO_CLK: R88.1 ; port WIFI_SDIO.SDIO_CLK
WIFI_SDIO_CMD: R87.2 U9.28(SDIO_CMD) ; port WIFI_SDIO.SDIO_CMD
WIFI_SDIO_DATA_0: R86.2 U9.30(SDIO_DATA_0) ; port WIFI_SDIO.SDIO_DATA_0
WIFI_SDIO_DATA_1: R85.2 U9.29(SDIO_DATA_1) ; port WIFI_SDIO.SDIO_DATA_1
WIFI_SDIO_DATA_2: R84.2 U9.32(SDIO_DATA_2) ; port WIFI_SDIO.SDIO_DATA_2
WIFI_SDIO_DATA_3: R83.2 U9.31(SDIO_DATA_3) ; port WIFI_SDIO.SDIO_DATA_3
WIFI_USB_DM: U9.46(USB2_DM) ; port WIFI_USB.WIFI_USB_DM
WIFI_USB_DP: U9.47(USB2_DP) ; port WIFI_USB.WIFI_USB_DP
WL_HOST_WAKE: U9.52(WL_HOST_WAKE) ; port MODULE_IO.WL_HOST_WAKE
WL_REG_EN: U9.4(WL_REG_EN)
NetAE1_4: AE1.4(FEED) C82.2 L7.2
NetC82_1: C82.1 J7.1(IN) L6.2
NetJ7_3: J7.3(OUT) U9.22(WL_ANT)

Not connected (* = marked no-connect by the designer): U9 15(NC)* 35(NC)* 36(NC)* 37(NC)* 38(NC)* 39(NC)* 40(NC)* 44(NC)* 58(NC)* 59(NC)* 60(NC)* 61(NC)* 62(NC)*

### Notes on the sheet
- (near J7) Antenna measurement port
- (in symbol C_0201) 0201
- (in symbol C_0402) 0402
- (in symbol LBEE5PK2AE-564, part A) LBEE5PK2AE - Connectivity
- (in symbol LBEE5PK2AE-564, part B) LBEE5PK2AE - Power

### Library data of the parts
AE1 = Antenna_Chip: Ceramic chip antenna with pin for PCB trace
C82 C84 C85 C87 = C_0201: MLCC 0201; Manufacturer_Name: *; Manufacturer_Part_Number: *
C83 C86 C88 = C_0402: MLCC 0402; Manufacturer_Name: *; Manufacturer_Part_Number: *
J7 = MM8030-2610RK0: SWG Connector Receptacle, Female Socket 50 Ohms Surface Mount Solder; Manufacturer_Name: *; Manufacturer_Part_Number: *; Value: MM8030-2610RK0
L6 L7 = L_0201: Inductor; Manufacturer_Name: *; Manufacturer_Part_Number: *; Value: *
L8 = L_0806: Inductor; Manufacturer_Name: *; Manufacturer_Part_Number: *
R83-R96 = R_0201: Manufacturer_Name: *; Manufacturer_Part_Number: *
U9 = LBEE5PK2AE-564: Murata Type 2AE Wi-Fi 802.11a/b/g/n/ac + Bluetooth 5.2 combo module, Infineon CYW4373E, SDIO/USB host interface, 8.0x7.8mm LGA-77; KiCad_Footprint: RF_Module:Murata_LBEE5PK2AE-564; Datasheet: https://www.murata.com/products/productdata/8816428220446/type2ae.pdf; ComponentLink1Description: Datasheet; ComponentLink1URL: https://www.murata.com/products/productdata/8816428220446/type2ae.pdf; Manufacturer_Name: *; Manufacturer_Part_Number: *